# EasyEDA Pro project ros小车控制板.epro, board ROS-CAR-PCB
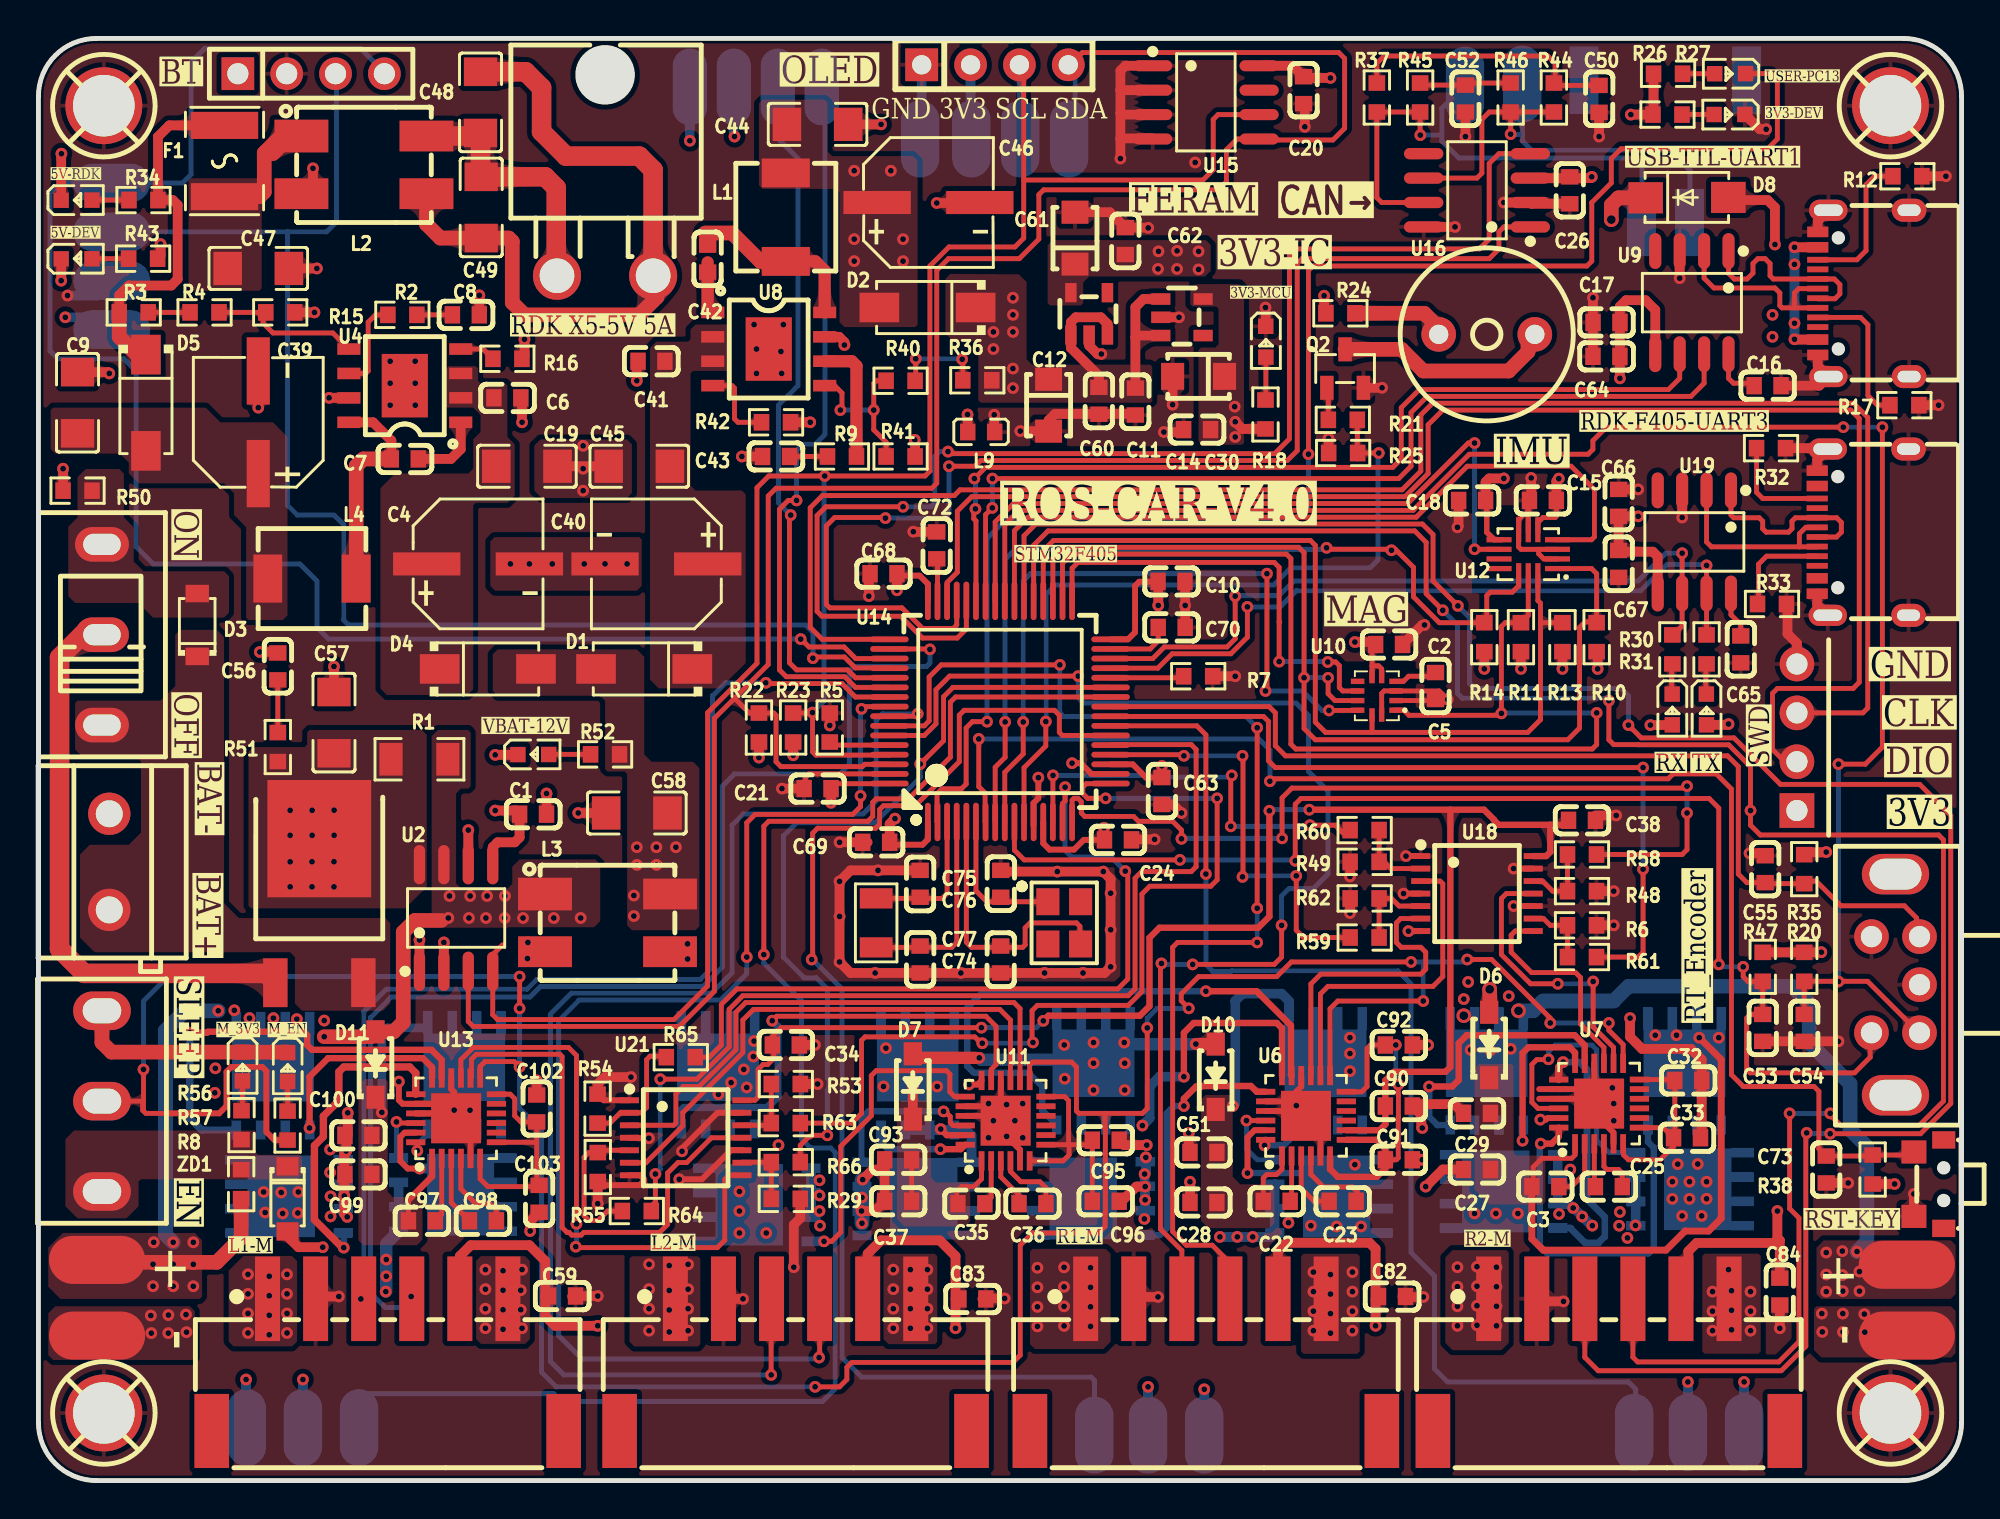
[diagram p3: board, top side]
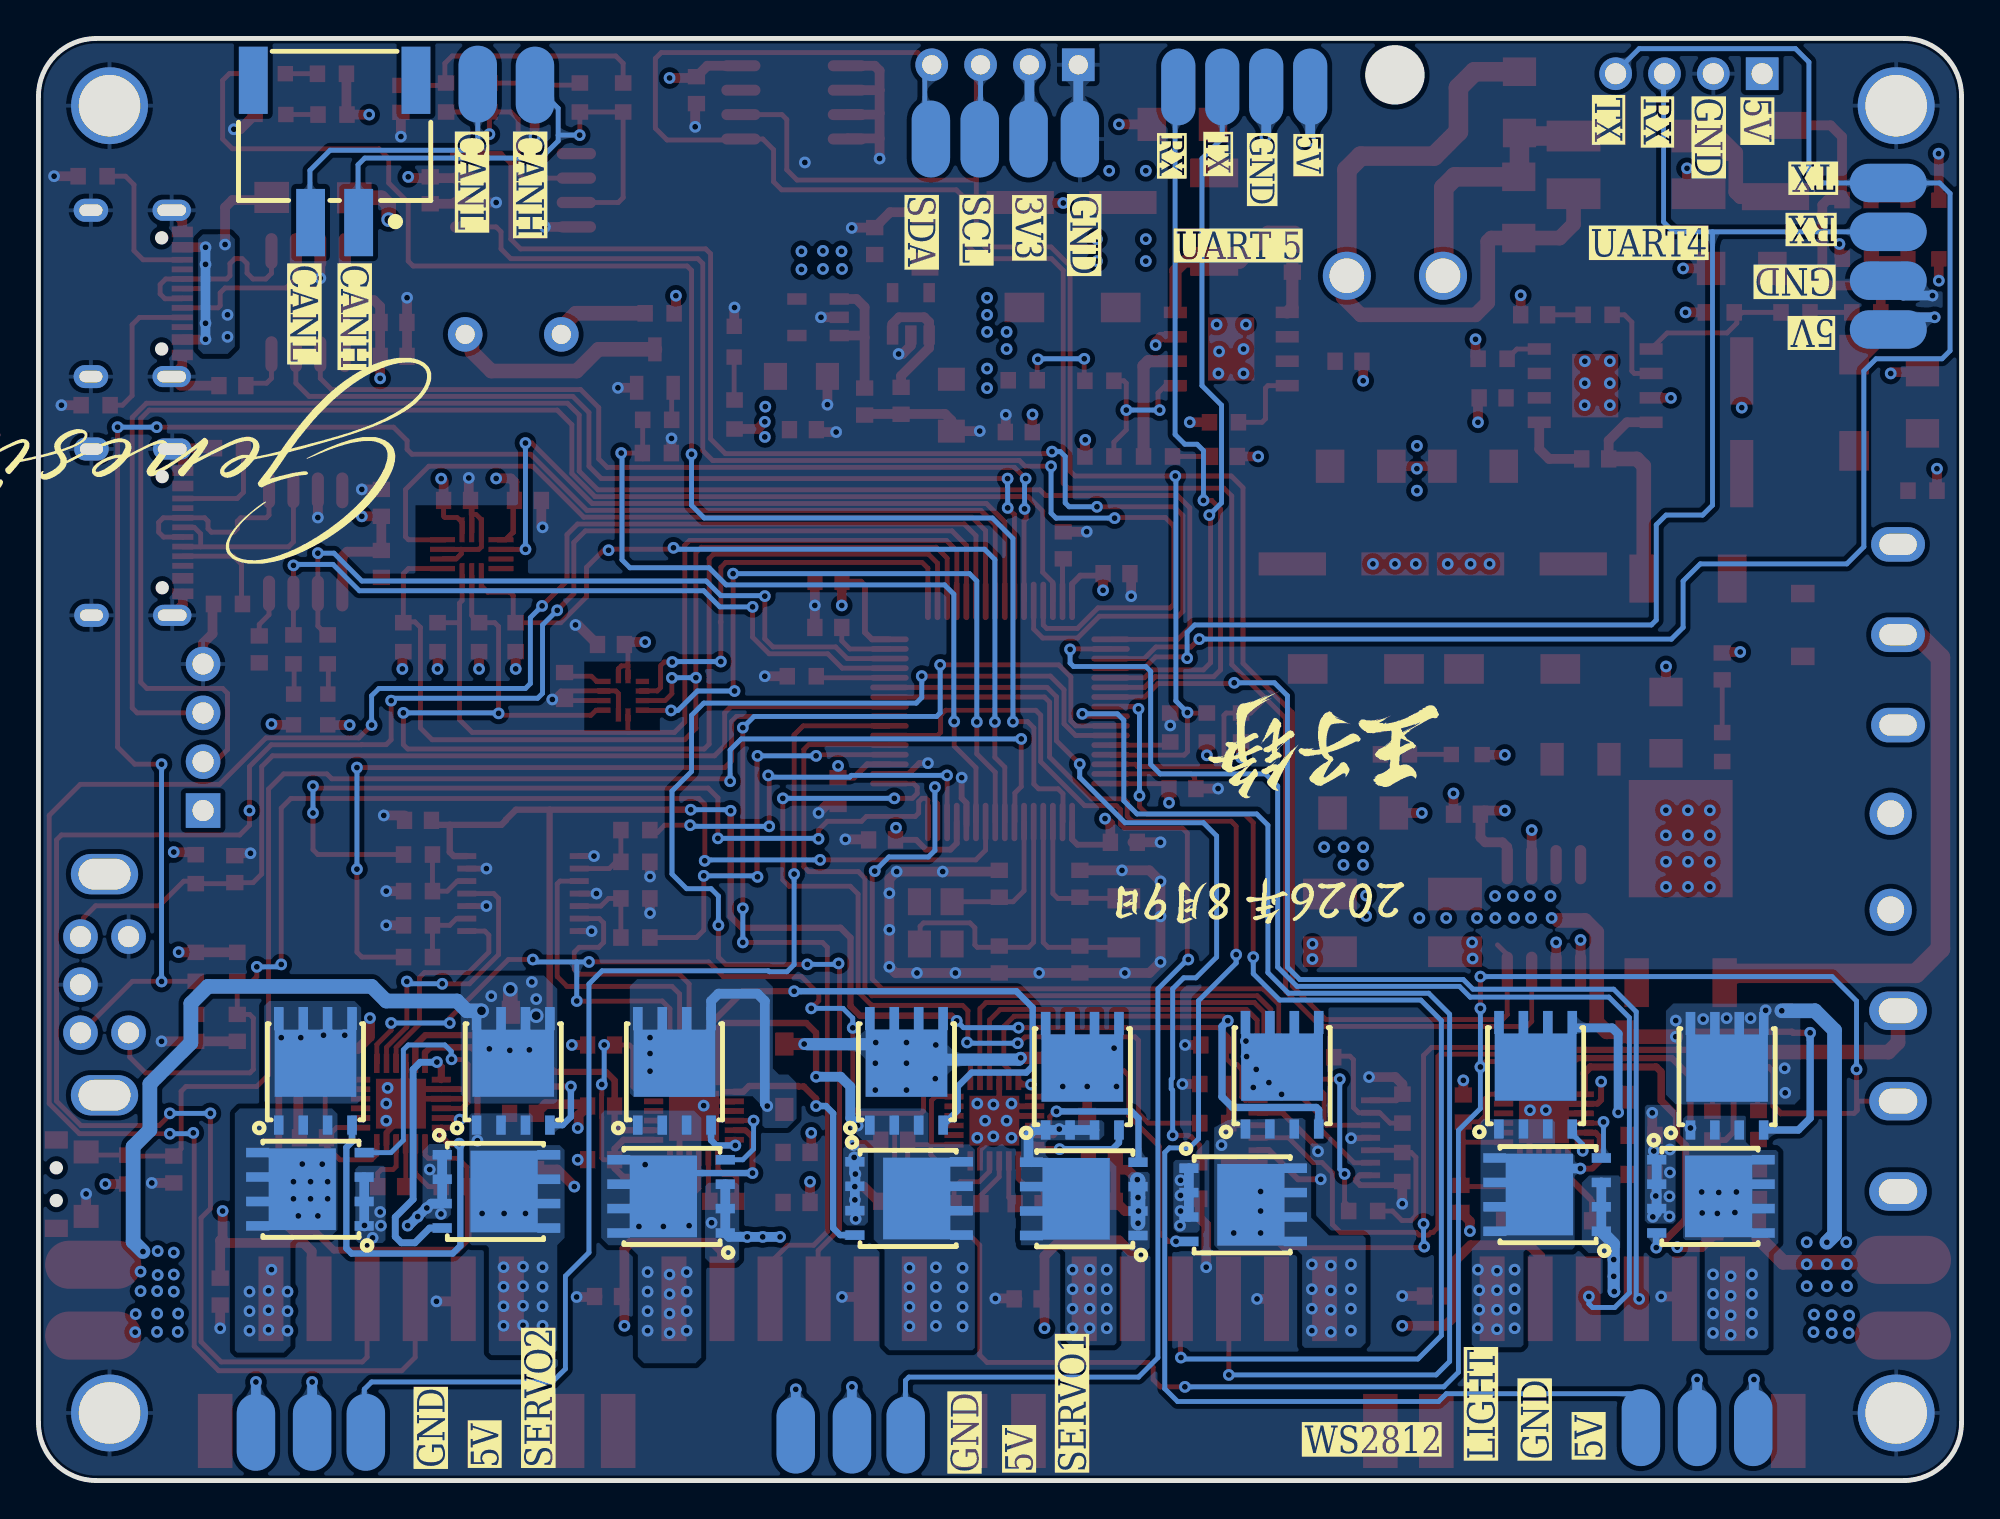
[diagram p4: board, bottom side, seen from below]

Outline 100 x 75 mm; copper layers: Top Layer, GND, VCC, Bottom Layer. Coordinates in mm from the lower left corner of the outline.
Outline path: 0,72 0,3 arc(0.88,0.88) 3,0 97,0 arc(99.12,0.88) 100,3 100,72 arc(99.12,74.12) 97,75 3,75 arc(0.88,74.12) 0,72
Stack: Top Layer 0.035mm 外层铜厚1oz / Dielectric1 0.2104mm 7628 RC49% 8.6mil / GND 0.0152mm 内层铜厚 / Dielectric2 1.065mm 1.1mm H/HOZ Copper / VCC 0.0152mm 内层铜厚 / Dielectric3 0.2104mm 7628 RC49% 8.6mil / Bottom Layer 0.035mm 外层铜厚1oz

## Design rules (mm)
net TC_DP: DP1
net TC_DN: DP1
net TC1_DP: DP2
net TC1_DN: DP2
spacing copperThickness1oz (default): track to track 0.102, other pairs 0.152 to 0.3
spacing copperThickness2oz: track to track 0.203, other pairs 0.152 to 0.3
spacing Plane_innerPlane: track to track 0.102, other pairs 0.152 to 0.3
spacing Copper_copperRegion: track to track 0.102, other pairs 0.152 to 0.3
spacing Copper_FULL: track to track 0.102, other pairs 0.152 to 0.3
spacing Copper_copperRegion_copperThickness1oz: track to track 0.102, other pairs 0.152 to 0.3
spacing Copper_copperRegion_Copper_copperRegion: track to track 0.102, other pairs 0.152 to 0.3
spacing Copper_copperRegion_Copper_FULL: track to track 0.102, other pairs 0.152 to 0.3
track width copperThickness1oz (default): min 0.127, default 0.254, max 2.54
track width copperThickness2oz: min 0.203, default 0.254, max 2.54
track width PWR: min 0.127, default 0.508, max 2.54
differential pair differentialPair (default): width min 0.127, default 0.254, max 2.54; gap min 0.152, default 0.152
net 5V uses FULL, PWR
net 3V3 uses PWR, copperRegion_copperThickness1oz
net GND uses PWR, copperRegion_copperThickness1oz
net ML1_OUTN uses PWR
net ML1_OUTP uses PWR
net MR1_OUTN uses PWR
net MR1_OUTP uses PWR
net 5V_RDK uses PWR
net DGND uses PWR, copperRegion_copperThickness1oz
net ML2_OUTN uses PWR
net ML2_OUTP uses PWR
net MR2_OUTN uses PWR
net MR2_OUTP uses PWR
net PGND uses PWR, copperRegion_copperThickness1oz
net VCCBAT uses PWR, copperRegion_copperThickness1oz
pour e1276 uses Copper_FULL, copperRegion_Copper_FULL_1
net VIN uses copperRegion_copperThickness1oz_1
pour e3355 uses Copper_FULL, copperRegion_Copper_FULL_1
pour e3357 uses Copper_copperRegion_copperThickness1oz, copperRegion_Copper_copperRegion_copperThickness1oz
pour e3399 uses Copper_copperRegion_copperThickness1oz, copperRegion_Copper_copperRegion_copperThickness1oz
pour e3413 uses Copper_copperRegion_copperThickness1oz, copperRegion_Copper_copperRegion_copperThickness1oz
pour e3419 uses Copper_copperRegion_copperThickness1oz, copperRegion_Copper_copperRegion_copperThickness1oz
pour e3481 uses Copper_copperRegion_copperThickness1oz, copperRegion_Copper_copperRegion_copperThickness1oz
pour e3537 uses Copper_copperRegion_copperThickness1oz, copperRegion_Copper_copperRegion_copperThickness1oz
pour e3834 uses Copper_copperRegion_copperThickness1oz, copperRegion_Copper_copperRegion_copperThickness1oz
net 3V3_MCU uses copperRegion_copperThickness1oz_1

## Placement (name value [footprint] x y rotation side)
5V  -  [Test-Point-0.5mm]  33.87 72.48 180 bottom
B1  HX-9042  [BUZ-TH_BD9.0-P4.00-D0.6-FD]  75.31 59.61 0 top
C1  100nF  [C0603]  25.72 34.66 180 top
C2  100nF  [C0603_1]  70.23 43.48 0 top
C3  1uF  [C0603_3]  78.36 15.29 180 top
C4  100uF  [CAP-SMD_BD6.3-L6.6-W6.6-LS7.6-FD-1]  22.86 47.67 0 top
C5  100nF  [C0603_1]  72.64 41.32 270 top
C6  100nF  [C0603]  24.38 56.31 180 top
C7  100nF  [C0603]  19.05 53.13 180 top
C8  100nF  [C0603]  22.22 60.63 180 top
C9  100nF  [C1206]  2.03 56.05 270 top
C10  100nF  [C0603_1]  58.92 46.76 0 top
C11  100nF  [C0603]  57.04 56.12 90 top
C12  10uF  [CAP-SMD_L3.2-W1.6]  52.53 55.93 270 top
C14  10uF  [CAP-SMD_L3.2-W1.6]  60.32 57.43 180 top
C15  100nF  [C0603_1]  78.23 50.97 0 top
C16  100nF  [C0603_1]  89.92 56.94 180 top
C17  100nF  [C0603_1]  81.54 60.23 0 top
C18  100nF  [C0603_1]  74.55 50.97 180 top
C19  100nF  [C1206]  25.4 52.75 180 top
C20  100nF  [C0603_1]  65.79 72.31 270 top
C21  100nF  [C0603_1]  40.51 35.99 180 top
C22  1uF  [C0603_3]  64.39 14.53 180 top
C23  100nF  [C0603_3]  67.82 14.53 0 top
C24  100nF  [C0603_1]  56.13 33.32 0 top
C25  100nF  [C0603_3]  81.66 15.29 0 top
C26  100nF  [C0603_1]  79.63 67.1 90 top
C27  100nF  [C0603_3]  74.8 16.18 0 top
C28  100nF  [C0603_3]  60.58 14.46 0 top
C29  10uF  [C0603_3]  74.8 19.1 180 top
C30  100nF  [C0603]  60.25 54.66 0 top
C32  1uF  [C0603_3]  85.79 20.81 180 top
C33  1uF  [C0603_3]  85.72 17.83 0 top
C34  1uF  [C0603_3]  38.86 22.65 180 top
C35  1uF  [C0603_3]  48.51 14.4 180 top
C36  100nF  [C0603_3]  51.69 14.4 0 top
C37  100nF  [C0603_3]  44.7 14.53 0 top
C38  1uF  [C0603_3]  80.26 34.34 180 top
C39  220uF  [CAP-SMD_BD6.3-L6.6-W6.6-LS7.2-FD]  11.43 55.04 90 top
C40  100uF  [CAP-SMD_BD6.3-L6.6-W6.6-LS7.6-FD-1]  32.13 47.67 180 top
C41  100nF  [C0603]  31.88 58.21 0 top
C42  100nF  [C0603]  34.8 63.55 90 top
C43  100nF  [C0603]  38.35 53.26 0 top
C44  100nF  [C1206]  40.51 70.53 180 top
C45  100nF  [C1206]  31.24 52.75 0 top
C46  220uF  [CAP-SMD_BD6.3-L6.6-W6.6-LS7.2-FD]  46.28 66.47 0 top
C47  10uF  [C1206]  11.43 63.04 180 top
C48  22uF  [C1206]  22.99 71.67 270 top
C49  22uF  [C1206]  23.02 66.21 90 top
C50  47nF  [C0603]  81.15 71.86 270 top
C51  10uF  [C0603_3]  60.58 17.06 180 top
C52  47nF  [C0603]  74.2 71.87 90 top
C53  100nF  [C0603_1]  89.66 23.54 90 top
C54  100nF  [C0603_1]  91.82 23.54 90 top
C55  100nF  [C0603_1]  89.79 31.8 90 top
C56  100nF  [C0603]  12.45 42.34 270 top
C57  10uF  [C1206]  15.37 39.42 270 top
C58  22uF  [C1206]  31.12 34.72 0 top
C59  100nF  [C0603]  27.23 9.6 180 top
C60  100nF  [C0603]  55.14 56.16 90 top
C61  10uF  [CAP-SMD_L3.2-W1.6]  53.9 64.61 90 top
C62  100nF  [C0603]  56.51 64.46 270 top
C63  100nF  [C0603_1]  58.42 35.86 270 top
C64  100nF  [C0603]  81.53 58.47 180 top
C65  0.1uF  [C0603]  88.52 43.23 270 top
C66  0.1uF  [C0603]  82.17 50.85 90 top
C67  100nF  [C0603]  82.17 47.67 270 top
C68  100nF  [C0603_1]  43.94 47.16 180 top
C69  100nF  [C0603_1]  43.56 33.19 180 top
C70  2.2uF  [C0603_5]  58.93 44.37 0 top
C72  2.2uF  [C0603_5]  46.71 48.64 90 top
C73  100nF  [C0603_1]  92.96 16.18 90 top
C74  22pF  [C0603_5]  50.04 27.1 90 top
C75  10pF  [C0603_5]  45.85 31.03 90 top
C76  22pF  [C0603_5]  50.04 31.03 270 top
C77  10pF  [C0603_5]  45.85 27.1 270 top
C82  100nF  [C0603]  70.38 9.57 180 top
C83  100nF  [C0603]  48.56 9.44 180 top
C84  100nF  [C0603]  90.55 9.83 90 top
C90  1uF  [C0603_3]  70.74 19.48 180 top
C91  1uF  [C0603_3]  70.74 16.68 180 top
C92  1uF  [C0603_3]  70.74 22.65 0 top
C93  10uF  [C0603_3]  44.7 16.68 180 top
C95  1uF  [C0603_3]  55.5 17.7 180 top
C96  1uF  [C0603_3]  55.5 14.53 0 top
C97  1uF  [C0603_3]  19.94 13.51 180 top
C98  100nF  [C0603_3]  23.11 13.51 0 top
C99  100nF  [C0603_3]  16.64 15.92 0 top
C100  10uF  [C0603_3]  16.64 17.95 180 top
C102  1uF  [C0603_3]  25.91 19.35 270 top
C103  1uF  [C0603_3]  26.03 14.65 270 top
CN1  ZX-XH2.54-2PWT  [CONN-SMD_2P-P2.54_MEGASTAR_ZX-XH2.54-2PWT]  84.6 69.12 0 bottom
CN2  HCZZ0021-6  [CONN-SMD_HCZZ0021-6]  60.71 6.02 0 top
CN6  HCZZ0021-6  [CONN-SMD_HCZZ0021-6]  81.66 6.02 0 top
CN7  XT30APW-M  [CONN-TH_XT30APW-M]  29.46 62.66 0 top
CN14  HCZZ0021-6  [CONN-SMD_HCZZ0021-6]  39.37 6.02 0 top
CN15  HCZZ0021-6  [CONN-SMD_HCZZ0021-6]  18.16 6.02 0 top
CRYSTAL1  8MHz  [CRYSTAL-SMD_4P-L3.2-W2.5-BL_SIT8008BI_1]  53.34 29 270 top
D1  SS54  [SMA_L4.4-W2.8-LS5.4-R-RD]  31.5 42.21 180 top
D2  SS54  [SMA_L4.4-W2.8-LS5.4-R-RD]  46.23 61.01 180 top
D3  BZT52C16  [SOD-123_L2.7-W1.6-LS3.7-RD]  8.25 44.5 90 top
D4  SS54  [SMA_L4.4-W2.8-LS5.4-R-RD]  23.37 42.21 0 top
D5  SS54  [SMA_L4.4-W2.8-LS5.4-R-RD]  5.59 56.05 270 top
D6  1N5819HW  [SOD-123_L2.7-W1.6-LS3.7-RD-1]  75.44 22.65 90 top
D7  1N5819HW  [SOD-123_L2.7-W1.6-LS3.7-RD-1]  45.47 20.49 90 top
D8  SS54  [SMA_L4.3-W2.6-LS5.0-FD]  85.72 66.72 180 top
D10  1N5819HW  [SOD-123_L2.7-W1.6-LS3.7-RD-1]  61.21 21 90 top
D11  1N5819HW  [SOD-123_L2.7-W1.6-LS3.7-RD-1]  17.53 21.64 90 top
F1  BSMD1812-400-16V  [F1812]  9.67 68.62 270 top
GND  -  [Test-Point-0.5mm]  36.16 72.48 180 bottom
H1  -  [HDR-TH_4P-P2.54-V-F]  14.18 73.17 0 top
H3  PZ254R-11-04P  [HDR-TH_4P-P2.54-H-M-W10.4]  91.44 38.66 90 top
K1  -  [SW-TH_SS-12D10-G050]  3.3 43.99 90 top
L1  4.7uH  [IND-SMD_L5.5-W5.2]  38.86 65.71 90 top
L2  ACM7060F-701T40  [FILTER-SMD_4P-L7.0-W6.0-TL_ACM7060F]  16.92 68.42 0 top
L3  ACM7060F-701T40  [FILTER-SMD_4P-L7.0-W6.0-TL_ACM7060F]  29.59 29 0 top
L4  4.7uH  [IND-SMD_L5.5-W5.2]  14.22 46.91 180 top
L9  FBMA-11-160808-221A20T  [L0603]  49.02 54.53 0 top
LED1  -  [LED_0603]  87.88 71.04 180 top
LED2  -  [LED_0603]  87.91 73.16 180 top
LED3  -  [LED_0603]  2.03 63.55 0 top
LED4  -  [LED_0603]  2.03 66.59 0 top
LED5  -  [LED_0603]  25.78 37.77 0 top
LED6  -  [LED_0603]  84.96 40.05 270 top
LED7  -  [LED_0603]  86.74 40.05 270 top
LED8  -  [LED_0603]  63.83 59.18 270 top
NOREF  -  [Pad_e1722]  3.05 7.54 90 top
NOREF#2  -  [Pad_e500]  51.05 69.77 0 top
NOREF#3  -  [Pad_e492]  57.7 2.36 0 top
NOREF#4  -  [Pad_e496]  13.75 2.75 0 top
NOREF#5  -  [Pad_e502]  82.98 2.51 0 top
NOREF#6  -  [Pad_e1721]  3.05 11.48 90 top
NOREF#7  -  [Pad_e501]  53.59 69.77 180 top
NOREF#8  -  [Pad_e506]  3.81 62.4 270 top
NOREF#9  -  [Pad_e491]  77.16 72.62 0 top
NOREF#10  -  [Pad_e4011]  97.16 11.22 90 top
NOREF#11  -  [Pad_e503]  85.77 2.51 0 top
NOREF#12  -  [Pad_e507]  3.81 64.94 90 top
NOREF#13  -  [Pad_e498]  45.85 69.77 0 top
NOREF#14  -  [Pad_e505]  3.81 59.86 90 top
NOREF#15  -  [Pad_e499]  48.51 69.77 0 top
NOREF#16  -  [Pad_e4010]  97.16 7.54 90 top
NOREF#17  -  [Pad_e497]  16.67 2.75 0 top
NOREF#18  -  [Pad_e508]  3.81 67.48 90 top
NOREF#19  -  [Pad_e490]  74.18 72.57 0 top
NOREF#20  -  [Pad_e493]  60.62 2.36 0 top
NOREF#21  -  [Pad_e495]  10.83 2.75 0 top
NOREF#22  -  [Pad_e504]  88.69 2.51 0 top
NOREF#23  -  [Pad_e494]  54.91 2.36 0 top
OLED1  HS96L01W4S03  [OLED-TH_HS96L01W4S03]  49.78 73.47 0 top
Q2  S8050  [SOT-23-3_L2.9-W1.3-P1.90-LS2.4-BR]  67.94 57.83 270 top
Q3  HY19P03D  [TO-252-3_L6.5-W5.8-P4.58-BL]  14.61 29.64 0 top
Q4  TPH1R403NL,L1Q(M  [DSOP-8_L5.0-W5.0-P1.27-LS6.0-BL-EP]  85.6 21.26 180 bottom
Q5  TPH1R403NL,L1Q(M  [DSOP-8_L5.0-W5.0-P1.27-LS6.0-BL-EP]  85.83 15.15 90 bottom
Q6  TPH1R403NL,L1Q(M  [DSOP-8_L5.0-W5.0-P1.27-LS6.0-BL-EP]  76.24 15.04 270 bottom
Q7  TPH1R403NL,L1Q(M  [DSOP-8_L5.0-W5.0-P1.27-LS6.0-BL-EP]  75.31 21.26 180 bottom
Q8  TPH1R403NL,L1Q(M  [DSOP-8_L5.0-W5.0-P1.27-LS6.0-BL-EP]  45.72 21 180 bottom
Q9  TPH1R403NL,L1Q(M  [DSOP-8_L5.0-W5.0-P1.27-LS6.0-BL-EP]  45.59 14.65 90 bottom
Q10  TPH1R403NL,L1Q(M  [DSOP-8_L5.0-W5.0-P1.27-LS6.0-BL-EP]  37.41 14.34 270 bottom
Q11  TPH1R403NL,L1Q(M  [DSOP-8_L5.0-W5.0-P1.27-LS6.0-BL-EP]  35.33 21.05 180 bottom
Q20  TPH1R403NL,L1Q(M  [DSOP-8_L5.0-W5.0-P1.27-LS6.0-BL-EP]  66.93 21.26 180 bottom
Q21  TPH1R403NL,L1Q(M  [DSOP-8_L5.0-W5.0-P1.27-LS6.0-BL-EP]  67.06 14.78 90 bottom
Q22  TPH1R403NL,L1Q(M  [DSOP-8_L5.0-W5.0-P1.27-LS6.0-BL-EP]  54.78 14.67 270 bottom
Q23  TPH1R403NL,L1Q(M  [DSOP-8_L5.0-W5.0-P1.27-LS6.0-BL-EP]  54.86 21.26 180 bottom
Q24  TPH1R403NL,L1Q(M  [DSOP-8_L5.0-W5.0-P1.27-LS6.0-BL-EP]  22.15 21.05 180 bottom
Q25  TPH1R403NL,L1Q(M  [DSOP-8_L5.0-W5.0-P1.27-LS6.0-BL-EP]  21.5 14.87 90 bottom
Q26  TPH1R403NL,L1Q(M  [DSOP-8_L5.0-W5.0-P1.27-LS6.0-BL-EP]  13.08 14.78 270 bottom
Q27  TPH1R403NL,L1Q(M  [DSOP-8_L5.0-W5.0-P1.27-LS6.0-BL-EP]  12.19 21 180 bottom
R1  10mR  [R1206]  19.81 37.51 0 top
R2  10K  [R0603_2]  18.92 60.63 180 top
R3  10K  [R0603_2]  4.95 60.75 180 top
R4  1.5K  [R0603_2]  8.64 60.75 180 top
R5  10kΩ  [R0603_1]  41.15 39.16 90 top
R6  10kΩ  [R0603_6]  80.26 28.88 0 top
R7  10K  [R0603_8]  60.31 41.83 180 top
R8  2.2K  [R0603_7]  10.54 15.41 270 top
R9  10K  [R0603_2]  41.78 53.26 0 top
R10  10kΩ  [R0603_1]  81.03 43.86 270 top
R11  2.2kΩ  [R0603_1]  77.09 43.86 270 top
R12  5.1K  [R0603]  97.18 67.84 180 top
R13  2.2kΩ  [R0603_1]  79.25 43.86 270 top
R14  10kΩ  [R0603_1]  75.18 43.86 270 top
R15  10K  [R0603_2]  12.57 60.75 0 top
R16  10K  [R0603_2]  24.38 58.34 180 top
R17  5.1K  [R0603]  97.03 55.93 180 top
R18  470R  [R0603]  63.81 55.44 270 top
R20  10K  [R0603]  91.82 26.72 90 top
R21  10K  [R0603_2]  67.83 55.17 180 top
R22  2.2K  [R0603_8]  37.47 39.16 270 top
R23  2.2K  [R0603_8]  39.24 39.16 270 top
R24  10K  [R0603_2]  67.7 60.71 0 top
R25  10K  [R0603_2]  67.84 53.44 180 top
R26  470R  [R0603]  84.71 71.04 180 top
R27  1K  [R0603]  84.74 73.16 180 top
R29  10kΩ  [R0603_6]  38.86 14.65 0 top
R30  10K  [R0603_2]  84.96 43.23 270 top
R31  10K  [R0603_2]  86.74 43.23 270 top
R32  5.1K  [R0603]  90.09 53.69 180 top
R33  5.1K  [R0603]  90.14 45.59 180 top
R34  10K  [R0603_2]  5.46 66.59 0 top
R35  10K  [R0603]  91.82 31.8 90 top
R36  10K  [R0603_2]  48.82 57.22 0 top
R37  60R  [R0603]  69.6 71.93 270 top
R38  10K  [R0603_8]  95.38 16.18 270 top
R40  1.5K  [R0603_2]  44.83 57.2 0 top
R41  10K  [R0603_2]  44.83 53.26 0 top
R42  10K  [R0603_2]  38.35 55.04 180 top
R43  10K  [R0603_2]  5.44 63.55 0 top
R44  60R  [R0603]  78.8 71.93 90 top
R45  60R  [R0603]  71.85 71.93 270 top
R46  60R  [R0603]  76.55 71.93 90 top
R47  10K  [R0603]  89.66 26.72 90 top
R48  10kΩ  [R0603_6]  80.26 30.65 180 top
R49  10kΩ  [R0603_6]  68.96 32.18 0 top
R50  10K  [R0603_2]  2.03 51.48 0 top
R51  10K  [R0603_2]  12.45 38.15 270 top
R52  10K  [R0603_2]  29.46 37.77 0 top
R53  10kΩ  [R0603_6]  38.86 20.62 180 top
R54  10kΩ  [R0603_6]  29.07 19.34 270 top
R55  10kΩ  [R0603_6]  29.08 16.3 90 top
R56  2.2kΩ  [R0603_6]  10.56 18.49 270 top
R57  2.2kΩ  [R0603_6]  12.95 18.46 270 top
R58  10kΩ  [R0603_6]  80.26 32.56 0 top
R59  10kΩ  [R0603_6]  68.96 28.24 180 top
R60  10kΩ  [R0603_6]  68.96 33.83 180 top
R61  10kΩ  [R0603_6]  80.26 27.22 0 top
R62  10kΩ  [R0603_6]  68.96 30.27 0 top
R63  10kΩ  [R0603_6]  38.86 18.59 0 top
R64  10kΩ  [R0603_6]  31.12 14.02 0 top
R65  10kΩ  [R0603_6]  33.4 22.02 0 top
R66  10kΩ  [R0603_6]  38.86 16.56 0 top
RX  -  [Test-Point-0.5mm]  40.73 72.48 180 bottom
SCREW1  -  [M3螺丝]  3.46 3.45 0 top
SCREW2  -  [M3螺丝]  96.37 71.44 0 top
SCREW3  -  [M3螺丝]  96.37 3.45 0 top
SCREW4  -  [M3螺丝]  3.46 71.44 0 top
SW1  EC11L1525G01  [SW-TH_ALPS_EC11L1525G01]  97.82 23.29 90 top
SW3  SS-12D10L5  [SW-TH_SS-12D10L5]  3.3 19.73 270 top
SW5  TS24CA  [SW-SMD_TS24CA_1]  98.3 15.41 270 top
TX  -  [Test-Point-0.5mm]  38.44 72.48 180 bottom
U1  RT9013-33GB  [SOT-23-5_L2.9-W1.6-P0.95-LS2.8-BR]  54.64 60.68 270 top
U2  INA219AID  [SOIC-8_L4.9-W3.9-P1.27-LS6.0-BL]  21.72 29.26 0 top
U3  KF301-5.0-2P  [CONN-TH_P5.00_KF301-5.0-2P]  3.68 32.18 270 top
U4  SCT2450STER  [ESOP-8_L4.9-W3.9-P1.27-LS6.0-BL-EP]  19.05 56.94 90 top
U5  RT9013-33GB  [SOT-23-5_L2.9-W1.6-P0.95-LS2.8-BR]  59.46 60.5 180 top
U6  DRV8701ERGER  [VQFN-24_L4.0-W4.0-P0.50-BL-EP2.5_1]  65.91 18.97 0 top
U7  DRV8701ERGER  [VQFN-24_L4.0-W4.0-P0.50-BL-EP2.5_1]  81.15 19.61 0 top
U8  SCT2450STER  [ESOP-8_L4.9-W3.9-P1.27-LS6.0-BL-EP]  37.97 58.85 270 top
U9  CH340N  [SOP-8_L4.9-W3.9-P1.27-LS6.0-BL]  85.98 61.26 180 top
U10  LIS3MDLTR  [LGA-12_L2.0-W2.0-P0.50-BL]  69.6 40.81 90 top
U11  DRV8701ERGER  [VQFN-24_L4.0-W4.0-P0.50-BL-EP2.5_1]  50.29 18.72 0 top
U12  LSM6DSRTR  [LGA-14_L3.0-W2.5-P0.50-BR]  77.47 48.18 0 top
U13  DRV8701ERGER  [VQFN-24_L4.0-W4.0-P0.50-BL-EP2.5_1]  21.72 18.84 0 top
U14  STM32F405RGT6  [LQFP-64_L10.0-W10.0-P0.50-LS12.0-BL]  50 40 0 top
U15  MB85RC64TAPNF-G-BDERE1  [SOP-8_L5.0-W4.0-P1.27-LS6.0-BL]  60.71 71.67 270 top
U16  TJA1050T-JSM  [SOIC-8_L4.9-W3.9-P1.27-LS6.0-BL]  74.8 67.1 90 top
U18  SN74HC125PWR  [TSSOP-14_L5.0-W4.4-P0.65-LS6.5-BL]  74.8 30.53 270 top
U19  CH340N  [SOP-8_L4.9-W3.9-P1.27-LS6.0-BL]  86.11 48.81 180 top
U21  SN74HC125PWR  [TSSOP-14_L5.0-W4.4-P0.65-LS6.5-BL]  33.66 17.83 270 top
USB1  TYPE-C 16PIN 2MD(073)  [USB-C-SMD_TYPE-C-6PIN-2MD-073]  94.9 61.74 90 top
USB2  TYPE-C 16PIN 2MD(073)  [USB-C-SMD_TYPE-C-6PIN-2MD-073]  94.87 49.32 90 top
X1  32.768kHz  [OSC-SMD_L3.2-W1.5]  43.56 29 90 top
ZD1  BZT52C3V3  [SOD-123_L2.8-W1.8-LS3.7-RD]  12.95 14.65 270 top
使能  NCD0603Y2  [LED0603-RD]  12.95 21.51 270 top
电源  NCD0603Y2  [LED0603-RD]  10.61 21.53 270 top

## Footprints (pads in the part's own frame, mm; a bottom-side part is the same pattern mirrored in y, then rotated)
BUZ-TH_BD9.0-P4.00-D0.6-FD
  round 1.8 hole 1: 1(-2.5,0) 2(2.5,0)
C0603
  rect 0.8x0.9 smd: 1(-0.7,0) 2(0.7,0)
C0603_1
  rect 0.8x0.9 smd: 1(-0.7,0) 2(0.7,0)
C0603_3
  rect 0.8x0.9 smd: 1(-0.7,0) 2(0.7,0)
C0603_5
  rect 0.8x0.9 smd: 1(-0.7,0) 2(0.7,0)
C1206
  rect 1.485x1.728 smd: 1(-1.593,0) 2(1.593,0)
CAP-SMD_BD6.3-L6.6-W6.6-LS7.2-FD
  rect 3.5x1.2 smd: 1(-2.67,0) 2(2.67,0)
CAP-SMD_BD6.3-L6.6-W6.6-LS7.6-FD-1
  rect 3.5x1.2 smd: 1(-2.67,0) 2(2.67,0)
CAP-SMD_L3.2-W1.6
  rect 1.2x1.4 smd: 1(-1.35,0) 2(1.35,0)
CONN-SMD_2P-P2.54_MEGASTAR_ZX-XH2.54-2PWT
  rect 1.5x3.5 smd: 1(-1.25,3.7) 2(1.25,3.7) 3(-4.23,-3.7) 4(4.23,-3.7)
CONN-SMD_HCZZ0021-6
  rect 1.3x4.4 smd: 1(-6.25,3.438) 2(-3.75,3.438) 3(-1.25,3.438) 4(1.25,3.438) 5(3.75,3.438) 6(6.25,3.438)
  rect 1.8x3.85 smd: 7(-9.15,-3.438) 8(9.15,-3.438)
CONN-TH_P5.00_KF301-5.0-2P
  round 2.2 hole 1.4: 1(-2.5,0) 2(2.5,0)
CONN-TH_XT30APW-M
  round 2.5 hole 1.8: 1(-2.5,0) 2(2.5,0)
CRYSTAL-SMD_4P-L3.2-W2.5-BL_SIT8008BI_1
  rect 1.4x1.2 smd: 1(-1.1,-0.85) 2(1.1,-0.85) 3(1.1,0.85) 4(-1.1,0.85)
DSOP-8_L5.0-W5.0-P1.27-LS6.0-BL-EP
  rect 0.5x1 smd: 1(-1.905,-2.77) 2(-0.635,-2.77) 3(0.634,-2.77) 4(1.905,-2.77)
  rect 0.5x1.2 smd: 5(1.905,2.77) 6(0.635,2.77) 7(-0.634,2.77) 8(-1.905,2.77)
  custom 4.25x3.5 smd: 9(0,0.45)
ESOP-8_L4.9-W3.9-P1.27-LS6.0-BL-EP
  rect 0.6x1.2 smd: 1(-1.905,-2.909) 2(-0.635,-2.909) 3(0.635,-2.909) 4(1.905,-2.909) 5(1.905,2.909) 6(0.635,2.909) 7(-0.635,2.909) 8(-1.905,2.909)
  rect 3.3x2.4 smd: 9(0,0)
F1812
  rect 1.407x3.499 smd: 1(-1.853,0) 2(1.853,0)
FILTER-SMD_4P-L7.0-W6.0-TL_ACM7060F
  rect 2.8x1.7 smd: 1(-3.251,1.5)
  rect 2.8x1.6 smd: 2(-3.251,-1.5) 3(3.251,-1.5) 4(3.251,1.5)
HDR-TH_4P-P2.54-H-M-W10.4
  rect 1.8x1.8 hole 1.1: 1(-3.81,0)
  round 1.8 hole 1.1: 2(-1.27,0) 3(1.27,0) 4(3.81,0)
HDR-TH_4P-P2.54-V-F
  rect 1.7x1.7 hole 1.1: 1(-3.81,0)
  round 1.7 hole 1.1: 2(-1.27,0) 3(1.27,0) 4(3.81,0)
IND-SMD_L5.5-W5.2
  rect 1.5x2.5 smd: 1(-2.3,0) 2(2.3,0)
L0603
  rect 0.8x0.864 smd: 1(-0.7,0) 2(0.7,0)
LED0603-RD
  rect 0.8x0.8 smd: 1(-0.749,0) 2(0.749,0)
LED_0603
  rect 0.8x0.8 smd: 1(-0.851,-0.01) 2(0.75,-0.005)
LGA-12_L2.0-W2.0-P0.50-BL
  rect 0.28x0.7 smd: 1(-0.75,-1) 2(-0.25,-1) 3(0.25,-1) 4(0.75,-1) 7(0.75,1) 8(0.25,1) 9(-0.25,1) 10(-0.75,1)
  rect 0.7x0.28 smd: 5(1,-0.25) 6(1,0.25) 11(-1,0.25) 12(-1,-0.25)
LGA-14_L3.0-W2.5-P0.50-BR
  rect 1.3x0.27 smd: 1(1.52,-0.75) 2(1.52,-0.25) 3(1.52,0.25) 4(1.52,0.75) 8(-1.52,0.75) 9(-1.52,0.25) 10(-1.52,-0.25) 11(-1.52,-0.75)
  rect 0.27x1.3 smd: 5(0.5,1.27) 6(0,1.27) 7(-0.5,1.27) 12(-0.5,-1.12) 13(0,-1.12) 14(0.5,-1.12)
LQFP-64_L10.0-W10.0-P0.50-LS12.0-BL
  oval 0.3x2 smd: 1(-3.75,-5.75) 2(-3.25,-5.75) 3(-2.75,-5.75) 4(-2.25,-5.75) 5(-1.75,-5.75) 6(-1.25,-5.75) 7(-0.75,-5.75) 8(-0.25,-5.75) 9(0.25,-5.75) 10(0.75,-5.75) 11(1.25,-5.75) 12(1.75,-5.75) 13(2.25,-5.75) 14(2.75,-5.75) 15(3.25,-5.75) 16(3.75,-5.75) 33(3.75,5.75) 34(3.25,5.75) 35(2.75,5.75) 36(2.25,5.75) 37(1.75,5.75) 38(1.25,5.75) 39(0.75,5.75) 40(0.25,5.75) 41(-0.25,5.75) 42(-0.75,5.75) 43(-1.25,5.75) 44(-1.75,5.75) 45(-2.25,5.75) 46(-2.75,5.75) 47(-3.25,5.75) 48(-3.75,5.75)
  oval 2x0.3 smd: 17(5.75,-3.75) 18(5.75,-3.25) 19(5.75,-2.75) 20(5.75,-2.25) 21(5.75,-1.75) 22(5.75,-1.25) 23(5.75,-0.75) 24(5.75,-0.25) 25(5.75,0.25) 26(5.75,0.75) 27(5.75,1.25) 28(5.75,1.75) 29(5.75,2.25) 30(5.75,2.75) 31(5.75,3.25) 32(5.75,3.75) 49(-5.75,3.75) 50(-5.75,3.25) 51(-5.75,2.75) 52(-5.75,2.25) 53(-5.75,1.75) 54(-5.75,1.25) 55(-5.75,0.75) 56(-5.75,0.25) 57(-5.75,-0.25) 58(-5.75,-0.75) 59(-5.75,-1.25) 60(-5.75,-1.75) 61(-5.75,-2.25) 62(-5.75,-2.75) 63(-5.75,-3.25) 64(-5.75,-3.75)
M3螺丝
  round 4 hole 3.2: 1(-0.064,0.064)
OLED-TH_HS96L01W4S03
  rect 1.7x1.7 hole 1: 1(-3.845,0.155)
  round 1.7 hole 1: 2(-1.305,0.155) 3(1.235,0.155) 4(3.775,0.155)
OSC-SMD_L3.2-W1.5
  rect 1.05x1.7 smd: 1(-1.275,0) 2(1.275,0)
Pad_e490
  oval 2x4 smd far side: 1(0,0)
Pad_e491
  oval 2x4 smd far side: 1(0,0)
Pad_e492
  oval 2x4 smd far side: 1(0,0)
Pad_e493
  oval 2x4 smd far side: 1(0,0)
Pad_e494
  oval 2x4 smd far side: 1(0,0)
Pad_e495
  oval 2x4 smd far side: 1(0,0)
Pad_e496
  oval 2x4 smd far side: 1(0,0)
Pad_e497
  oval 2x4 smd far side: 1(0,0)
Pad_e498
  oval 2x4 smd far side: 1(0,0)
Pad_e499
  oval 2x4 smd far side: 1(0,0)
Pad_e500
  oval 2x4 smd far side: 1(0,0)
Pad_e501
  oval 2x4 smd far side: 1(0,0)
Pad_e502
  oval 2x4 smd far side: 1(0,0)
Pad_e503
  oval 2x4 smd far side: 1(0,0)
Pad_e504
  oval 2x4 smd far side: 1(0,0)
Pad_e505
  oval 2x4 smd far side: 1(0,0)
Pad_e506
  oval 2x4 smd far side: 1(0,0)
Pad_e507
  oval 2x4 smd far side: 1(0,0)
Pad_e508
  oval 2x4 smd far side: 1(0,0)
Pad_e1721
  oval 2.5x5 smd: 1(0,0)
Pad_e1722
  oval 2.5x5 smd: 1(0,0)
Pad_e4010
  oval 2.5x5 smd: 1(0,0)
Pad_e4011
  oval 2.5x5 smd: 1(0,0)
R0603
  rect 0.806x0.864 smd: 1(-0.753,0) 2(0.753,0)
R0603_1
  rect 0.806x0.864 smd: 1(-0.753,0) 2(0.753,0)
R0603_2
  rect 0.806x0.864 smd: 1(-0.753,0) 2(0.753,0)
R0603_6
  rect 0.806x0.864 smd: 1(-0.753,0) 2(0.753,0)
R0603_7
  rect 0.806x0.864 smd: 1(-0.753,0) 2(0.753,0)
R0603_8
  rect 0.806x0.864 smd: 1(-0.753,0) 2(0.753,0)
R1206
  rect 1.208x1.701 smd: 1(-1.479,0) 2(1.479,0)
SMA_L4.3-W2.6-LS5.0-FD
  rect 1.8x1.62 smd: 1(-2.15,-0.009) 2(2.15,0.009)
SMA_L4.4-W2.8-LS5.4-R-RD
  rect 2.062x1.539 smd: 1(2.503,0) 2(-2.503,0)
SOD-123_L2.7-W1.6-LS3.7-RD
  rect 0.91x1.22 smd: 1(-1.635,0) 2(1.635,0)
SOD-123_L2.7-W1.6-LS3.7-RD-1
  rect 1.2x0.95 smd: 1(-1.7,0) 2(1.7,0)
SOD-123_L2.8-W1.8-LS3.7-RD
  rect 0.95x1.15 smd: 1(-1.692,0) 2(1.692,0)
SOIC-8_L4.9-W3.9-P1.27-LS6.0-BL
  oval 0.588x2.045 smd: 1(-1.905,-2.772) 2(-0.635,-2.772) 3(0.635,-2.772) 4(1.905,-2.772) 5(1.905,2.772) 6(0.635,2.772) 7(-0.635,2.772) 8(-1.905,2.772)
SOP-8_L4.9-W3.9-P1.27-LS6.0-BL
  oval 0.63x1.865 smd: 1(-1.905,-2.683) 2(-0.635,-2.683) 3(0.635,-2.683) 4(1.905,-2.683) 5(1.905,2.683) 6(0.635,2.683) 7(-0.635,2.683) 8(-1.905,2.683)
SOP-8_L5.0-W4.0-P1.27-LS6.0-BL
  oval 0.574x2.035 smd: 1(-1.905,-2.768) 2(-0.635,-2.768) 3(0.635,-2.768) 4(1.905,-2.768) 5(1.905,2.768) 6(0.635,2.768) 7(-0.635,2.768) 8(-1.905,2.768)
SOT-23-3_L2.9-W1.3-P1.90-LS2.4-BR
  rect 1.25x0.7 smd: 1(1,-0.95) 2(1,0.95) 3(-1,0)
SOT-23-5_L2.9-W1.6-P0.95-LS2.8-BR
  rect 1x0.6 smd: 1(1.1,-0.95) 2(1.1,0) 3(1.1,0.95) 4(-1.1,0.95) 5(-1.1,-0.95)
SW-SMD_TS24CA_1
  rect 0.9x1.2 smd: 1(-2.3,0.775) 2(2.3,0.775)
  rect 1.2x1.3 smd: 3(-1.675,-0.775) 4(1.675,-0.775)
SW-TH_ALPS_EC11L1525G01
  oval 2.1x3.5 hole 1.6x2.7: 6(-3.25,1.25) 7(8.25,1.25)
  round 1.8 hole 1.1: A(0,0) B(5,0) C(2.5,0) D(0,2.5) E(5,2.5)
SW-TH_SS-12D10-G050
  oval 1.8x2.8 hole 1.1x1.95: 1(-4.7,0) 2(0,0) 3(4.7,0)
SW-TH_SS-12D10L5
  oval 2x3 hole 1.3x2: 1(-4.7,0) 2(0,0) 3(4.7,0)
Test-Point-0.5mm
  oval 1.778x3.988 smd: 1(0,0)
TO-252-3_L6.5-W5.8-P4.58-BL
  rect 1.27x2.54 smd: 1(-2.288,-3.747) 3(2.288,-3.745)
  rect 5.4x6.1 smd: 2(-0.002,3.747)
TSSOP-14_L5.0-W4.4-P0.65-LS6.5-BL
  rect 0.305x0.991 smd: 1(-1.95,-2.925) 2(-1.3,-2.925) 3(-0.65,-2.925) 4(0,-2.925) 5(0.65,-2.925) 6(1.3,-2.925) 7(1.95,-2.925) 8(1.95,2.925) 9(1.3,2.925) 10(0.65,2.925) 11(0,2.925) 12(-0.65,2.925) 13(-1.3,2.925) 14(-1.95,2.925)
USB-C-SMD_TYPE-C-6PIN-2MD-073
  rect 0.55x1.1 smd: 1(-3.2,2.375) 2(-2.4,2.375) 11(2.4,2.375) 12(3.2,2.375)
  rect 0.3x1.1 smd: 3(-1.75,2.375) 4(-1.25,2.375) 5(-0.75,2.375) 6(-0.25,2.375) 7(0.25,2.375) 8(0.75,2.375) 9(1.25,2.375) 10(1.75,2.375)
  oval 1.1x2 hole 0.6x1.5: 13(-4.325,1.825) 14(4.325,1.825)
  oval 1.2x1.8 hole 0.6x1.2: 13(-4.325,-2.375) 14(4.325,-2.375)
VQFN-24_L4.0-W4.0-P0.50-BL-EP2.5_1
  rect 0.3x1 smd: 1(-1.25,-2.092) 2(-0.75,-2.092) 3(-0.25,-2.092) 4(0.25,-2.092) 5(0.75,-2.092) 6(1.25,-2.092) 13(1.25,2.092) 14(0.75,2.092) 15(0.25,2.092) 16(-0.25,2.092) 17(-0.75,2.092) 18(-1.25,2.092)
  rect 1x0.3 smd: 7(2.098,-1.25) 8(2.098,-0.75) 9(2.098,-0.25) 10(2.098,0.25) 11(2.098,0.75) 12(2.098,1.25) 19(-2.098,1.25) 20(-2.098,0.75) 21(-2.098,0.25) 22(-2.098,-0.25) 23(-2.098,-0.75) 24(-2.098,-1.25)
  rect 2.6x2.6 smd: 25(0.001,-0.001)

## Nets
As in the schematic, except:
3V3: C1.2 C2.1 C15.2 C17.2 C18.1 C20.1 C59.2 C61.1 C62.2 C64.1 C66.1 C67.1 C82.2 C83.2 C84.2 CN2.5 CN6.5 CN14.5 CN15.5 H3.1 LED6.2 LED7.2 NOREF#15.1 OLED1.2 R10.2 R11.2 R13.2 R14.2 R20.2 R24.1 R26.2 R27.2 R35.2 R38.2 R47.2 U1.5 U2.5 U9.5 U10.5 U10.6 U12.5 U12.8 U15.8 U19.5
5V: 5V.1 C11.2 C12.1 C26.2 C60.2 D2.2 D8.2 H1.1 NOREF#3.1 NOREF#11.1 NOREF#14.1 NOREF#21.1 R36.2 R43.2 U1.1 U1.3 U5.1 U5.3 U16.3
DGND: C2.2 C5.2 C10.2 C11.1 C12.2 C14.2 C15.1 C16.1 C17.1 C18.2 C20.2 C21.2 C24.2 C26.1 C30.1 C34.1 C38.1 C50.2 C52.1 C53.1 C54.1 C55.2 C59.1 C60.1 C61.2 C62.1 C63.2 C64.2 C65.2 C66.2 C67.2 C68.2 C69.2 C70.2 C72.2 C73.1 C74.1 C75.2 C76.1 C77.2 C82.1 C83.1 C84.1 CN2.2 CN6.2 CN14.2 CN15.2 H1.2 H3.4 L9.2 LED1.1 LED8.1 NOREF#8.1 NOREF#13.1 OLED1.1 Q2.2 R5.2 R6.2 R7.1 R12.1 R17.1 R25.2 R29.2 R32.1 R33.1 R48.1 R49.1 R53.1 R54.1 R55.1 R62.1 SCREW1.1 SCREW2.1 SCREW3.1 SCREW4.1 SW1.C SW1.E SW5.4 U1.2 U5.2 U9.3 U12.2 U12.3 U12.6 U12.7 U14.12 U14.18 U14.63 U15.1 U15.2 U15.3 U15.4 U16.2 U16.8 U18.1 U18.4 U18.7 U18.10 U18.13 U19.3 U21.1 U21.4 U21.7 U21.10 U21.13 USB1.1 USB1.12 USB1.13 USB1.14 USB2.1 USB2.12 USB2.13 USB2.14
PGND: C4.2 C6.1 C8.1 C9.1 C19.1 C27.1 C28.1 C29.2 C32.1 C33.2 C37.1 C39.2 C40.2 C41.1 C43.1 C44.1 C45.1 C46.2 C47.1 C51.2 C58.1 C90.1 C91.1 C92.2 C93.2 C95.1 C96.2 C99.1 C100.2 C102.1 C103.2 GND.1 L2.2 L3.3 L9.1 LED3.1 LED4.1 LED5.1 NOREF.1 NOREF#4.1 NOREF#16.1 NOREF#20.1 NOREF#22.1 Q5.1 Q5.2 Q5.3 Q6.1 Q6.2 Q6.3 Q9.1 Q9.2 Q9.3 Q10.1 Q10.2 Q10.3 Q21.1 Q21.2 Q21.3 Q22.1 Q22.2 Q22.3 Q25.1 Q25.2 Q25.3 Q26.1 Q26.2 Q26.3 R15.2 R16.1 R41.2 R42.1 SW3.1 U4.7 U4.9 U6.5 U6.16 U6.20 U6.21 U6.25 U7.5 U7.16 U7.20 U7.21 U7.25 U8.7 U8.9 U11.5 U11.16 U11.20 U11.21 U11.25 U13.5 U13.16 U13.20 U13.21 U13.25 ZD1.2 使能.1 电源.1
VIN: D6.2 D7.2 D10.2 D11.2 L3.1 NOREF#6.1 NOREF#10.1 Q7.5 Q7.6 Q7.7 Q7.8 Q7.9 Q11.5 Q11.6 Q11.7 Q11.8 Q11.9 Q23.5 Q23.6 Q23.7 Q23.8 Q23.9 Q27.5 Q27.6 Q27.7 Q27.8 Q27.9 R1.2 R8.2 U2.7
BLUTOOTH_RX: H1.3 NOREF#12.1 U14.52
BLUTOOTH_TX: H1.4 NOREF#18.1 U14.51
CANH: CN1.1 NOREF#19.1 R37.2 R45.2 U16.7
CANL: CN1.2 NOREF#9.1 R44.1 R46.1 U16.6
I2C1_SCL: NOREF#2.1 OLED1.3 R23.1 U2.4 U14.61 U15.6
I2C1_SDA: NOREF#7.1 OLED1.4 R22.1 U2.3 U14.62 U15.5
IMU_MOSI: R13.1 U12.14 U14.36
IMU_SCK: R11.1 U12.13 U14.34
LIGHT: NOREF#17.1 U14.26
LIS3_DRDY: U14.33
SERVO1: NOREF#23.1 U14.22
SERVO2: NOREF#5.1 U14.23

Pads without a net: CN1 3 4; CN2 7 8; CN6 7 8; CN14 7 8; CN15 7 8; CRYSTAL1 2 4; SW1 6 7; SW5 1 2; U1 4; U5 4; U6 9 10 11; U7 8 9 10 11; U9 4; U10 1 2 3 4 7 8 11 12; U11 8 9 10 11; U12 10 11; U13 8 9 10 11; U15 7; U16 5; U19 4; USB1 3 9; USB2 2 3 9 11

## Via types
v1: diameter 0.61, hole 0.305, Top Layer to Bottom Layer, 649 vias
v2: diameter 0.762, hole 0.457, Top Layer to Bottom Layer, 4 vias

## Routing (per net, layer and track width the routed paths; a pad name or vN(x,y) marks a point on that pad's centre or on a via; arc(x,y) is an arc through that point)
3V3: length 103.4
  Top Layer w0.254: 77.97,49.3 77.97,49.82 78.23,50.08 78.87,50.08 78.93,50.15 78.93,50.87 ; 69.35,42.37 69.69,42.37 69.85,42.22 69.85,41.69 ; 69.35,42.37 69.35,41.69 ; 69.35,42.37 69.35,43.3 C2.1
  Top Layer w0.28: 76.1,48.93 75.7,48.93 75.31,49.32 75.31,50.91 C18.1
  Top Layer w0.508: 81.08,43.15 v1(81.08,42.21) ; v1(87.88,39.34) 87.84,39.3 LED7.2 ; v1(92.71,27.48) 92.7,27.47 R20.2 R47.2 ; 78.93,50.87 78.93,51.98 v1(79.06,52.11) ; v1(90.42,14.02) 90.42,12.61 90.55,12.48 ; LED6.2 84.94,39.29 v1(83.82,39.29) ; v1(47.69,7.92) 47.69,11.67 46.86,12.49 43.81,12.49 43.12,11.8 CN14.5 ; U19.5 84.2,48.05 83.95,48.31 82.23,48.31 C67.1 82.17,50.15 v1(83.19,50.15) ; 66.95,60.71 66.85,60.8 v1(66.85,61.62) ; 85.79,9.45 85.79,11.93 86.22,12.36 90.42,12.36 90.55,12.48 ; v1(29.08,8.05) 26.86,8.05 26.35,8.56 26.35,11.41 25.53,12.24 22.48,12.24 21.91,11.67 CN15.5 ; C18.1 75.25,51.93 75.44,52.12 v1(76.2,52.12) ; U15.8 65.22,73.58 65.85,72.94 v1(67.18,72.94) ; v1(23.75,34.84) 24.83,34.84 25.02,34.66 25.02,33.45 24.77,33.19 23.88,33.19 23.62,32.94 U2.5 ; C84.2 90.55,12.48 ; 69.53,9.42 C82.2 ; 69.53,9.42 69.53,12.05 69.22,12.37 64.9,12.37 64.46,11.93 CN2.5 ; 69.53,9.42 v1(69.53,8.05) ; 79.38,43.11 79.25,42.98 v1(79.25,42.21) ; v1(68.45,43.61) 69.4,43.61 C2.1 ; R11.2 v1(77.09,42.21) ; R38.2 v1(96.52,15.42) ; v1(92.96,32.69) 92.96,32.68 91.82,32.68 ; U9.5 84.07,60.88 83.57,61.39 82.56,61.39 82.23,61.06 v1(82.23,57.32) ; R14.2 v1(75.18,42.21) ; R27.2 83.99,71.07 R26.2 v1(82.8,71.04)
  Bottom Layer w0.508: OLED1.2 48.47,69.74 48.45,69.72
  vias: v1(58.24,63.93) v1(58.22,63.01) v1(59.21,63.95) v1(59.21,63.01) v1(60.32,63.93) v1(60.32,62.99)
3V3_MCU: length 30.2
  Top Layer w0.254: U14.64 44.24,36.24 41.47,36.24 C21.1
  Top Layer w0.305: C24.1 54.36,33.32 53.85,32.81 52.58,32.81 52.25,33.14 U14.13 ; C63.1 57.59,36.56 56.9,37.25 U14.19 ; U14.48 46.25,46.63 45.82,47.06 44.7,47.06 44.64,47 ; 44.64,46.83 44.62,46.81 ; U14.1 46.25,33.34 45.97,33.07 44.39,33.07 C69.1 ; 58.23,46.66 58.14,46.74 57.24,46.74 57.02,46.53 57.02,44.12 56.66,43.75 U14.32
  Top Layer w0.508: 58.23,46.66 v1(58.23,45.51) ; R22.2 v1(37.47,37.6) ; C24.1 55.41,33.35 v1(55.41,33.95) ; C63.1 v1(58.42,37.17) ; v1(62.23,55.06) 62.6,54.69 R18.2 ; 44.59,47.11 44.64,47.06 v1(44.64,46.3) ; v1(44.54,34.43) 44.26,34.15 C69.1 ; C21.1 41.21,35.25 ; R23.2 v1(39.24,37.72)
  vias: v1(41.21,35.25) v1(62.2,55.85) v1(62.23,54.28)
5V: length 33.8
  Top Layer w0.508: 57.04,59.45 57.14,59.55 U5.3 ; 57.04,59.45 57.04,61.02 57.47,61.45 U5.1 ; 57.04,59.45 C11.2 ; v1(6.35,64.31) 6.35,63.7 R43.2 ; 55.59,59.53 55.6,59.54 55.6,60.14 55.25,60.5 53.94,60.5 53.69,60.24 53.69,58.91 55.14,57.45 C60.2 ; U16.3 80.71,67.74 v1(80.77,67.8)
  Top Layer w0.762: v2(81.79,65.58) 81.79,66.34 82.16,66.71 D8.2
  Bottom Layer w0.508: NOREF#21.1 10.8,2.79 v1(10.8,5.25) ; 33.91,69.64 v1(33.87,69.68) 5V.1 ; v1(1.4,60.5) 3.17,60.5 NOREF#14.1 ; NOREF#11.1 v1(85.77,5.13) ; NOREF#3.1 v1(57.7,4.87)
  vias: v1(49.66,59.74) v1(49.66,58.85) v1(50.67,61.52) v1(50.67,60.63) v1(50.67,59.74) v1(50.67,57.83) v1(50.67,56.82)
5V_RDK: length 19.5
  Top Layer w0.508: 9.91,70.48 6.81,70.48 6.21,69.89 R34.2 6.98,66.59 7.24,66.34 7.24,62.48 6.91,62.15 4.7,62.15 4.2,61.65 R3.2
  Top Layer w0.762: R3.2 4.2,59.47 5.12,58.56 D5.2
5V_RDK_1: length 13.4
  Top Layer w1.016: L2.4 22.58,69.92 ; CN7.1 26.92,62.7 26.92,67.23 26.35,67.8 C49.2 22.99,67.84 C48.2
DGND: length 193.5
  Top Layer w0.254: 78.01,48.43 78.01,48.2 78.28,47.93 U12.2 ; 78.01,48.43 U12.3 ; 78.01,48.43 77.09,48.43 76.96,48.56 76.96,49.29 76.97,49.3 76.97,49.97 77.25,50.24 77.47,50.24 77.47,49.3 ; 39.88,36.05 39.88,36.57 40.06,36.75 U14.63 ; 69.85,39.94 69.85,40.94 69.98,41.07 70.47,41.07 70.47,41.06 72.84,41.06 v1(73.28,40.62) 73.22,40.56 70.47,40.56
  Top Layer w0.305: 77.47,50.24 77.47,50.81 ; v1(31.74,17.8) 31.18,17.8 31.16,17.83 U21.4 ; U18.4 v1(70.99,30.53) ; v1(71.24,28.57) 71.87,28.57 U18.7 ; U18.10 v1(76.71,29.88) ; U18.13 v1(76.71,31.83) ; U21.10 36.56,17.19 36.02,17.19 34.5,15.67 v1(33.32,15.67) ; U21.7 31.29,15.88 31.5,15.67 31.5,15.59 31.27,15.36 29.27,15.36 R55.1 ; v1(53.75,37.31) 54.2,37.31 54.76,36.75 U14.18 ; R54.1 29.39,19.78 U21.1 ; v1(33.46,17.12) 33.46,17.28 35.31,19.13 U21.13 ; 51.74,34.07 51.74,35.23 51.99,35.49 v1(51.99,36.56) ; U18.1 v1(71.11,32.48)
  Top Layer w0.508: R6.2 v1(81.91,28.88) ; 56.26,72.31 56.26,71.11 ; 56.26,72.31 56.26,73.33 56.51,73.58 U15.1 ; 56.26,72.31 56.26,72.31 U15.2 ; 56.26,71.11 56.34,71.04 U15.3 ; 56.26,71.11 56.26,69.8 ; 70.93,9.57 70.96,9.55 v1(72.01,9.55) ; 92.88,53.49 92.49,53.1 USB2.12 ; v1(68.2,31.42) 68.21,31.42 R49.1 ; C11.1 56.99,55.47 52.86,55.47 52.53,55.14 52.53,54.58 51.06,54.58 v1(51.05,54.58) ; v1(43.18,46) 43.18,47.1 43.19,47.11 ; 27.75,9.57 27.78,9.6 v1(29.08,9.6) ; 56.26,69.8 v1(56.26,68.75) ; 56.26,69.8 57.91,69.8 U15.4 ; C5.2 v1(73.28,40.62) ; 90.95,45.54 90.95,44.04 91.44,43.55 91.44,42.34 ; R12.1 v1(99.19,67.84) ; R32.1 93,53.69 USB2.14 ; R62.1 68.21,29.52 v1(68.2,29.51) ; v1(36.64,9.44) 35.63,9.44 CN14.2 ; v1(57.71,65.15) 57.69,65.16 C62.1 55.71,65.96 C61.2 ; C50.2 v1(81.15,69.9) ; v1(77.62,52.14) 77.62,50.96 77.47,50.81 ; v1(89.84,70.28) 89.51,70.28 88.74,71.05 ; USB1.12 92.52,65.52 USB1.14 ; 68.9,56.83 v1(69.87,56.83) ; 80.83,58.34 v1(80.83,61.52) ; v1(72.07,44.5) 71.95,44.5 70.93,43.48 ; v1(30.81,20.98) 29.45,20.98 29.07,20.61 R54.1 ; R55.1 v1(29.08,14.4) ; L9.2 49.7,54.55 v1(49.7,55.43) ; C70.2 v1(59.63,45.51) 59.63,46.66 ; C73.1 v1(94.11,15.48) ; C66.2 v1(83.19,51.55) ; C63.2 58.99,35.16 v1(59.44,34.72) ; v1(58.04,33.35) 56.86,33.35 C24.2 ; C76.1 50.1,31.67 v1(52.98,31.67) v1(55.37,31.67) 55.75,31.29 v1(55.75,30.55) v1(55.75,28.64) v1(55.75,26.72) 55.43,26.4 v1(54.32,26.4) v1(52.32,26.4) C74.1 v1(47.97,26.4) C77.2 v1(43.51,26.4) 42.23,26.4 v1(41.66,26.97) v1(41.66,29.34) v1(41.66,31.16) 42.23,31.73 v1(43.66,31.73) C75.2 ; 43.12,33.19 v1(41.66,33.19) ; 65.85,71.55 v1(65.85,70.41) ; R17.1 v1(98.81,55.93) ; U16.8 v1(73.66,65.2) ; R48.1 v1(81.91,30.65) ; CN15.2 14.53,9.57 v1(15.62,9.57) ; LED8.1 63.82,60.99 v1(63.81,61.01) ; 91.69,22.84 C53.1 ; v1(79.3,9.32) 78.05,9.32 CN6.2 ; 92.49,46.12 92.49,45.55 USB2.13 ; v1(73.79,49.58) 73.85,49.64 73.85,50.97 ; R29.2 39.62,13.64 39.28,13.31 v1(39.28,11.1) ; R25.2 67.09,54.19 v1(67.08,54.2) ; 59.57,54.53 v1(58.52,54.53) ; 49.09,9.44 49.11,9.47 v1(50.24,9.47) ; C54.1 v1(93.6,22.84) ; R5.2 v1(41.15,39.27) ; 80.96,34.59 v1(82.04,34.59) ; C34.1 v1(40.38,22.65) ; U19.3 v1(85.47,50.08) ; 54.64,59.53 54.64,59.03 55.07,58.59 v1(55.27,58.59) ; C84.1 v1(90.55,7.92) ; CN2.2 57.05,9.55 v1(58.22,9.55) ; U5.2 v1(59.31,60.5) ; USB1.1 92.52,57.96 93.07,57.42 92.6,56.94 C16.1 ; R53.1 v1(40.51,20.62) ; v1(45.49,49.35) 45.5,49.34 C72.2 ; U9.3 v1(85.34,62.53) ; 79.63,66.4 77.64,66.4 U16.2 v1(76.2,66.47) ; 89.79,32.62 v1(88.98,32.62) ; 74.2,71.17 v1(74.2,69.9) ; 39.81,35.99 v1(38.66,35.99) ; 58.97,57.04 v1(58.97,55.95) ; R7.1 v1(62.23,41.83) ; 97.52,13.74 v1(97.52,14.91)
  Bottom Layer w0.508: 45.4,69.72 45.85,70.16 ; OLED1.1 45.93,69.99 45.66,69.72 ; NOREF#8.1 3.03,61.63 v1(1.51,61.63)
  vias: v1(60.15,68.55)
DVDD: length 80.5
  Top Layer w0.254: U21.14 37.26,19.78 37.43,19.95 37.43,21.38 37.68,21.64 37.92,21.64 38.23,21.94 38.23,22.59 C34.2 38.16,23.1 38.62,23.55 v1(49.03,23.55)
  Top Layer w0.33: v1(66.08,34.89) 73.42,34.89 ; 73.42,34.89 75.17,34.89 75.69,34.37 75.69,34.34 75.93,34.1 78.61,34.1 ; 73.42,34.89 73.42,21.51 73.16,21.26 70.49,21.26 70.04,20.81 C90.2 70.04,18.52 69.74,18.22 U6.8 ; C38.2 79.33,34.1 78.61,34.1 ; v1(52.25,23.91) 52.52,24.18 57.28,24.18 57.77,24.67 57.77,28.23 58.29,28.75 63.42,28.75 64.01,29.33 v1(64.01,34.83) ; 78.61,34.1 78.61,32.69 78.4,32.48 U18.14
  Bottom Layer w0.254: v1(64.01,34.83) 64.06,34.89 v1(66.08,34.89) ; v1(52.25,23.91) 51.9,23.55 v1(49.03,23.55)
GND: length 10.5
  Top Layer w0.508: U2.6 v1(22.35,33.83) ; C56.1 12.39,43.09 v1(11.51,43.09) ; U2.2 v1(21.08,27.99) ; U2.1 v1(19.81,28.11) ; v1(25.45,27.99) 25.86,27.99 L3.2 ; R50.1 v1(1.28,52.62) ; C1.1 v1(26.42,35.73) ; C57.1 v1(15.37,42.34)
  vias: v1(25.43,27.15)
PGND: length 159.7
  Top Layer w0.305: U11.16 50.04,18.97 U11.21 ; v1(49.4,19.61) 49.26,19.47 U11.20 ; 78.04,20.36 80.15,20.36 ; 81.15,19.48 U7.25 ; 81.15,19.48 81.15,18.84 81.9,18.09 U7.5 ; 81.15,19.48 80.9,19.73 80.9,20.36 ; 81.15,19.48 v1(81.92,18.72) ; 80.9,20.36 U7.16 ; 80.9,20.36 80.97,20.42 v1(81.84,20.42) ; 80.9,20.36 80.15,20.36 ; 65.41,19.47 v1(65.41,19.5) 65.41,20.23 65.66,20.48 U6.16 ; 65.41,19.47 65.16,19.72 U6.20 ; 65.41,19.47 65.66,19.22 U6.21 ; U13.20 18.94,19.59 18.74,19.79 v1(18.74,20.75) ; 80.15,20.36 80.65,19.86 78.04,19.86 ; U13.5 22.47,18.57 22.07,18.97 ; U11.5 51.04,17.2 v1(50.35,17.9) 49.66,18.59 v1(49.66,18.72) ; U6.25 66.66,18.22 U6.5 ; U13.16 21.47,20.35 21.62,20.21 v1(21.62,19.27)
  Top Layer w0.33: v1(21.62,19.27) 21.77,19.27 22.07,18.97 ; v1(21.62,19.27) 21.29,19.59 U13.20 ; v1(21.62,19.27) 21.44,19.09 U13.21
  Top Layer w0.508: 32.84,27.5 33.25,27.91 v1(33.75,27.91) ; v1(48.31,55.44) 48.32,55.43 L9.1 ; C102.1 v1(25.91,20.81) ; C92.2 v1(72.26,22.65) ; C39.2 v1(11.43,55.8) ; C6.1 25.15,56.25 v1(25.15,55.04) ; 71.91,18.33 71.91,19.01 C90.1 71.54,19.58 73.62,19.58 C29.2 ; v1(41.91,59.06) 41.91,59.21 41.63,59.48 U8.7 ; C91.1 v1(71.96,16.68) ; LED3.1 v1(1.18,62.4) ; 14.28,66.87 v1(14.28,68.25) ; v1(57.63,17.45) 56.45,17.45 56.2,17.7 ; C47.1 v1(14.48,63.04) ; v1(59.82,18.08) 59.82,17.13 C51.2 ; v1(46.71,66.44) 49,66.44 49.03,66.47 ; 56.33,14.53 57.09,15.29 v1(57.55,15.29) ; v1(72.14,15.29) 73.03,16.18 C27.1 ; v1(36.58,53.26) C43.1 ; C28.1 v1(59.88,15.54) ; C33.2 86.49,17.89 C32.1 86.49,21.89 85.93,22.45 83.39,22.45 82.76,23.07 v1(82.76,24.05) ; R15.2 v1(14.35,60.75) ; U4.7 v1(15.11,56.31) ; LED5.1 24.92,37.74 v1(23.75,37.74) ; R16.1 25.27,58.48 v1(25.27,59.36) ; R41.2 45.58,54.11 v1(45.57,54.12) ; v1(1.19,69.01) 1.18,69 LED4.1 ; R42.1 v1(40.13,55.04) ; v1(25.57,12.98) 25.57,13.48 C103.2 ; 44,16.16 C37.1 43.5,14.02 v1(42.8,14.02) ; 44,16.16 43.37,16.16 v1(42.86,15.65) ; 44,16.16 C93.2 ; ZD1.2 12.95,12.7 13.52,12.14 v1(14.78,12.14) ; C9.1 3.61,57.65 v1(3.68,57.58) ; v1(16.05,13.71) 15.9,13.86 v1(15.9,14.8) 15.9,17.04 v1(16,17.14) 16,17.89 16.08,17.97 v1(16.08,19.12) ; 31.18,58.21 31.12,58.15 v1(31.12,57.2) ; C8.1 v1(22.92,61.64) ; C45.1 C19.1 ; C58.1 v1(28.07,34.72) ; C44.1 v1(43.81,70.53)
  Top Layer w0.762: SW3.1 3.3,22.78 3.8,22.28 电源.1 12.93,22.28 使能.1
  Bottom Layer w0.508: v1(80.8,13.26) 80.75,13.26 v1(80.28,13.73) 79.83,14.18 v1(79.8,14.18) 79.58,14.4 Q6.3 Q6.2 Q6.1 ; 40.18,16.25 40.18,13.71 ; Q5.1 83.06,13.25 ; 83.06,13.25 83.06,15.78 ; 83.06,13.25 v1(83.05,13.27) ; NOREF#22.1 v1(88.69,5.13) ; NOREF#20.1 v1(60.62,4.75) ; 18.73,12.97 18.73,15.51 ; v1(36.19,69.9) 36.16,69.94 GND.1 ; Q21.3 Q21.2 Q21.1 64.08,12.67 v1(63.14,12.67) v1(62.34,12.67) v1(61.44,12.67) ; 57.55,15.28 v1(57.55,14.6) Q22.3 ; 57.55,15.28 Q22.2 57.52,15.33 v1(57.52,15.94) 57.58,16 v1(57.58,16.81) ; 57.55,15.28 v1(57.55,15.29) ; NOREF#4.1 v1(13.75,5.25) ; Q26.1 Q26.2 Q26.3 15.85,13.91 v1(16.05,13.71)
  Bottom Layer w0.635: 18.73,12.97 18.08,12.32 v1(18.08,11.49) v1(18.08,10.62) 18.08,9.85 v1(18.06,9.83)
  Bottom Layer w0.762: v1(42.86,15.65) 42.82,15.61 v1(42.82,14.72) v1(42.82,13.38)
  vias: v1(5.84,8.58) v1(5.87,7.67) v1(6.76,8.61) v1(6.75,7.67) v1(7.67,8.63) v1(7.7,7.72) v1(15.16,17.22) v1(15.16,16.02) v1(15.19,14.78) v1(15.19,13.74) v1(18.29,58.21) v1(18.29,57.07) v1(18.29,55.93) v1(19.59,58.21) v1(19.59,57.07) v1(19.59,55.93) v1(22.44,19.26) v1(24.54,47.67) v1(25.53,47.67) v1(26.72,47.67) v1(28.32,53.81) v1(28.32,52.62) v1(28.32,51.48) v1(28.38,47.67) v1(29.46,47.67) v1(30.61,47.67) v1(33.76,27.12) v1(37.21,60.12) v1(37.34,58.85) v1(37.34,57.58) v1(38.61,58.72) v1(38.65,57.58) v1(38.74,60.12) v1(40.61,15.62) v1(40.61,14.83) v1(40.61,14.02) v1(40.64,13.25) v1(49.4,17.83) v1(50.34,19.55) v1(50.77,18.72) v1(51.18,19.61) v1(51.18,17.83) v1(57.51,13.61) v1(65,13.41) v1(71.96,18.33) v1(79.07,13.86) v1(79.65,16.18) v1(81.91,19.61) v1(82.23,13.97) v1(82.19,13.25) v1(82.63,12.62) v1(92.74,8.68) v1(92.76,7.73) v1(93.83,8.68) v1(93.84,7.73) v1(94.94,8.66) v1(94.97,7.72)
VBUS: length 11.8
  Top Layer w0.508: v1(90.3,64.28) 90.3,66.21 89.92,66.59 88.01,66.59 D8.1 ; USB1.2 91.33,59.34 v1(91.31,59.36) ; USB1.11 v1(91.31,64.14)
  Bottom Layer w0.508: v1(91.31,59.36) v1(91.31,60.19) v1(91.31,63.25) v1(91.31,64.14)
  vias: v1(90.17,60.63) v1(90.17,59.48)
VCCBAT:
  vias: v1(30.96,30.43) v1(30.96,29.36) v1(31.12,32.94) v1(31.12,32.02) v1(32.13,32.94) v1(32.14,32.02) v1(33.15,32.94)
VIN: length 81.4
  Top Layer w0.635: D7.2 45.68,21.98 48.74,21.98 ; D10.2 v1(60.19,22.7)
  Top Layer w0.762: 3.17,11.35 9.27,11.35 10.54,12.62 R8.2 ; 75.44,24.35 75.46,24.38 v2(75.46,25.55) ; 20.95,29.13 19.58,29.13 18.97,28.52 18.97,23.84 18.46,23.34 D11.2 17.27,23.08 v1(14.86,23.08)
  Bottom Layer w0.508: v1(60.19,22.7) 60.18,22.69 60.03,22.69
  Bottom Layer w0.635: v1(56.46,22.78) 56.55,22.69 60.03,22.69 ; v1(48.92,21.98) 49.01,21.89 54.68,21.89 v1(54.86,21.71)
  Bottom Layer w0.762: v2(76.96,24.43) 77.72,24.43 78.23,24.94 81.91,24.94 82.68,25.7 91.19,25.7 92.07,24.81 92.07,22.76 94.21,20.63 94.21,18.24 95.08,17.36 95.08,12.42 v1(94.56,11.91) ; v1(9.35,24.43) 7.62,24.43 6.6,23.42 6.6,12.79 v1(7,12.39)
  vias: v1(5.99,12.39) v1(5.96,11.25) v1(5.96,10.11) v1(7,11.25) v1(7,10.11) v1(8.05,12.39) v1(8.05,11.25) v1(8.05,10.11) v1(9.2,21.44) v1(9.17,20.16) v1(10.19,24.46) v1(10.97,24.05) v1(12.22,24.05) v1(13.44,24) v1(14.86,23.92) v1(21.31,29.26) v1(21.37,30.4) v1(22.45,30.4) v1(22.39,29.26) v1(23.33,30.4) v1(23.27,29.26) v1(24.24,29.26) v1(24.26,30.4) v1(25.2,29.26) v1(26.8,29.26) v1(28.19,29.26) v1(35.36,20.09) v1(36.02,20.7) v1(36.68,21.38) v1(36.83,20.44) v1(37.21,22.86) v1(37.18,22.05) v1(53.34,22.65) v1(53.37,20.9) v1(54.86,22.78) v1(54.86,20.31) v1(56.48,21.71) v1(56.48,20.31) v1(74.12,25.04) v1(74.35,25.93) v1(74.47,22.4) v1(75.49,22.37) v1(76.45,25.19) v1(76.56,22.45) v1(92.96,11.86) v1(92.96,10.72) v1(92.96,9.83) v1(93.8,11.93) v1(93.8,10.69) v1(93.83,9.85) v1(94.69,10.87) v1(94.69,9.85) v2(74.12,24.18)
BLUTOOTH_RX: length 72.4
  Top Layer w0.254: U14.52 44.24,42.26 42.48,42.26 41.91,42.83 40.33,42.83 v1(40.27,42.77)
  Bottom Layer w0.254: v1(40.27,42.77) 40.27,44.11 39.88,44.5 16.13,44.5 15.88,44.75 15.88,49.7 15.37,50.21 13.46,50.21 12.95,50.72 12.95,64.94 ; 12.95,64.94 NOREF#12.1 ; 12.95,64.94 14.99,64.94 15.49,65.45 15.49,73.2
BLUTOOTH_TX: length 89.7
  Top Layer w0.254: v1(39.64,43.76) 39.66,43.76 40.07,43.35 41.89,43.35 42.5,42.75 U14.51
  Bottom Layer w0.254: v1(39.64,43.76) 15.09,43.76 14.48,44.37 14.48,46.78 13.59,47.67 5.97,47.67 5.08,48.56 5.08,57.7 4.44,58.34 1.02,58.34 0.6,58.76 0.6,66.94 1.14,67.48 NOREF#18.1 7.49,67.48 7.94,67.93 7.94,73.77 8.64,74.47 16.76,74.47 18.03,73.2
BOOT0: length 3.2
  Top Layer w0.254: U14.60 41.31,38.25 R5.1
BOOT1: length 3.8
  Top Layer w0.254: R7.2 59.47,41.75 U14.28
BUZZER: length 39
  Top Layer w0.254: R25.1 v1(69.7,53.44) ; U14.11 51.25,37.07 52.38,38.2 v1(52.38,39.47) ; R21.1 68.58,53.13
  Bottom Layer w0.254: v1(52.38,39.47) 52.4,39.49 52.4,46.1 52.88,46.58 64.24,46.58 65.13,47.47 69.24,47.47 69.66,47.89 69.66,53.4 v1(69.7,53.44)
CAN1_RX: length 69.3
  Top Layer w0.254: v1(44.96,50.64) 40.94,50.64 40.49,50.19 40.49,45.2 40.74,44.95 44.84,44.95 45.97,43.82 47.78,43.82 48.25,44.29 U14.44 ; U16.4 75.95,69.01 75.44,68.5 75.44,64.56 74.93,64.06 65.3,64.06 65.05,63.8 65.05,54.17 64.28,53.41 47.4,53.41 v1(47.29,53.51)
  Bottom Layer w0.254: v1(44.96,50.64) 46.41,50.64 46.61,50.85 46.61,53.26 46.86,53.51 v1(47.29,53.51)
CAN1_TX: length 63.4
  Top Layer w0.254: U14.45 47.75,44.5 47.57,44.32 45.97,44.32 44.9,45.39 41.15,45.39 40.97,45.57 40.97,49.65 41.4,50.08 44.01,50.08 v1(44.04,50.05) ; U16.1 76.2,65.2 75.95,64.94 75.95,64.06 75.44,63.55 65.71,63.55 65.46,63.29 65.46,53.56 64.94,53.05 48.99,53.05 48.7,52.75 v1(47.35,52.75)
  Bottom Layer w0.254: v1(44.04,50.05) 47.09,50.05 47.35,50.31 v1(47.35,52.75)
CANH: length 29
  Top Layer w0.254: v1(71.86,69.97) 71.85,69.98 R45.2 R37.2 69.6,66.72 69.85,66.47 U16.7
  Bottom Layer w0.254: 72.97,69.96 72.97,71.37 NOREF#19.1 ; 72.97,69.96 72.96,69.97 v1(71.86,69.97) ; 72.97,69.96 72.97,69.67 73.86,68.78 83.03,68.78 83.38,68.43 83.38,65.36
CANL: length 26.7
  Top Layer w0.254: R46.1 v1(76.55,70.02) ; R46.1 75.45,71.18 75.06,70.79 75.06,67.99 74.8,67.74 U16.6 ; R46.1 R44.1
  Bottom Layer w0.254: v1(76.55,70.02) 76.58,70 77.16,70 ; 77.16,70 77.16,69.68 77.65,69.19 84.84,69.19 85.88,68.14 85.88,65.36 ; 77.16,70 NOREF#9.1
DEBUG_RX: length 48.1
  Top Layer w0.254: U9.6 85.34,57.32 84.76,56.74 71.81,56.74 70.87,55.8 70.87,53.13 70.43,52.69 49.25,52.69 v1(48.67,52.11) ; U14.43 48.75,49.91 48.64,50.02 48.64,50.45 v1(48.72,50.53)
  Bottom Layer w0.254: v1(48.72,50.53) 48.72,52.05 v1(48.67,52.11)
DEBUG_TX: length 48.7
  Top Layer w0.254: U14.42 49.25,50.23 v1(49.6,50.59) ; v1(49.61,52.11) 70.73,52.11 71.37,52.75 71.37,55.55 72.21,56.38 85.93,56.38 86.61,57.07 U9.7
  Bottom Layer w0.254: v1(49.61,52.11) 49.61,51.69 49.6,51.68 v1(49.6,50.59)
GMR_L1A: length 60.6
  Top Layer w0.254: CN2.4 61.96,11.32 61.04,12.24 59.69,12.24 58.98,12.95 58.98,27.73 59.23,27.99 v1(63.37,27.99) ; U14.58 46.06,39.25 46.31,39.5 46.31,41.79 46.95,42.42 v1(53.11,42.42) ; v1(63.37,39.15) v1(63.37,29.77)
  Bottom Layer w0.254: v1(63.37,39.15) 62.79,39.74 53.3,39.74 53.11,39.92 v1(53.11,42.42) ; v1(63.37,29.77) v1(63.37,27.99)
GMR_L1B: length 64.5
  Top Layer w0.254: U14.59 46.06,38.75 46.67,39.36 46.67,41.13 47.38,41.84 53.85,41.84 ; v1(60.02,26.84) 64.26,26.84 64.64,27.22 v1(64.64,28.88) ; CN2.3 59.46,11.97 58.34,13.08 58.34,26.84 v1(58.4,26.89)
  Bottom Layer w0.254: v1(64.64,28.88) 64.64,30.4 65.02,30.78 66.29,30.78 67.06,31.54 67.06,35.86 66.04,36.88 66.04,39.8 65.41,40.43 54.36,40.43 54.07,40.72 v1(54.07,41.84) ; v1(58.4,26.89) 58.45,26.84 v1(60.02,26.84)
GMR_L2A: length 110.5
  Top Layer w0.254: U14.37 51.75,48.64 52.5,49.39 71.56,49.39 72.16,48.79 72.16,46.12 v1(73.03,45.26) ; v1(91.06,19.1) 91.06,14.14 91.55,13.66 91.55,7.22 90.5,6.17 83.16,6.17 82.91,6.42 CN6.4 ; v1(81.66,40.56) 81.66,38.53 81.91,38.27 83.19,38.27 83.2,38.27 87.89,38.27 89.03,37.13 v1(89.03,34.84) 89.03,34.08 89.53,33.58 98.81,33.58 99.06,33.32 99.06,19.73 97.79,18.46 93.73,18.46 93.12,19.07 93.12,19.1
  Bottom Layer w0.254: v1(81.66,40.56) 81.53,40.69 74.04,40.69 73.79,40.94 73.79,44.5 v1(73.03,45.26) ; 93.12,19.1 v1(91.06,19.1)
  vias: v1(93.17,19.1)
GMR_L2B: length 112
  Top Layer w0.254: v1(91.95,18.08) 91.9,18.03 91.9,6.99 90.63,5.71 81.11,5.71 80.41,6.41 CN6.3 ; v1(82.68,39.29) 83.34,38.62 88.17,38.62 90.59,36.21 97.83,36.21 99.44,34.59 99.44,19.61 97.87,18.04 v1(93.17,18.04) ; v1(73.81,45.49) 72.52,46.78 72.52,49.2 71.97,49.75 51.86,49.75 51.25,49.14 U14.38
  Bottom Layer w0.254: v1(73.81,45.49) 74.42,44.88 74.42,41.45 74.68,41.19 82.3,41.19 82.68,40.81 v1(82.68,39.29) ; v1(91.95,18.08) 91.99,18.04 v1(93.17,18.04)
GMR_R1A: length 65
  Top Layer w0.254: v1(42.75,35.61) 42.75,35.05 42.34,34.64 37.26,34.64 36.83,34.21 v1(36.83,27.22) ; v1(40.59,6.4) 40.62,6.42 CN14.4 ; U14.56 42.92,40.25 v1(42.8,40.13)
  Bottom Layer w0.254: v1(40.59,6.4) 40.52,6.32 28.27,6.32 27.05,7.54 27.05,23.92 28.12,24.99 35.46,24.99 36.83,26.36 v1(36.83,27.22) ; v1(42.8,40.13) 42.75,40.08 v1(42.75,35.61)
GMR_R1B: length 67.8
  Top Layer w0.254: v1(38.1,5.49) 38.1,9.43 CN14.3 ; v1(45.72,39.88) 45.59,39.75 U14.57
  Bottom Layer w0.254: v1(38.1,5.49) 27.32,5.49 26.62,6.19 26.62,24.25 27.71,25.34 35,25.34 36.07,26.41 36.07,34.08 36.65,34.67 42.88,34.67 43.56,35.35 43.56,39.54 43.89,39.88 v1(45.72,39.88)
GMR_R2A: length 65.1
  Top Layer w0.254: v1(46.35,43.23) 46.33,43.25 U14.50
  Bottom Layer w0.254: v1(46.35,43.23) 46.35,42.52 46.18,42.34 42.42,42.34 42.16,42.08 42.16,37.24 41.67,36.75 36.19,36.75 35.56,36.11 35.56,26.7 34.56,25.7 26.11,25.7 25.55,25.14 18.34,25.14 17.27,24.08 17.27,9.76 18.03,9 19.19,9 19.38,9.19 v1(19.38,9.57)
GMR_R2B: length 58
  Top Layer w0.254: U14.55 42.48,40.75 41.78,41.45 37.86,41.45 v1(37.82,41.49)
  Bottom Layer w0.254: v1(16.76,9.44) 16.92,9.6 16.92,24.38 18.09,25.55 25.4,25.55 25.91,26.06 34.41,26.06 35.05,26.7 35.05,40.81 35.73,41.49 v1(37.82,41.49)
I2C1_SCL: length 116
  Top Layer w0.254: 24.13,27.86 23.62,27.35 U2.4 23.62,24.23 23.88,23.97 33.05,23.97 34.79,25.72 34.79,39.93 37.36,42.5 37.36,51.63 37.97,52.24 v1(40.89,52.24) 46.1,52.24 46.35,52.5 46.35,63.17 47.35,64.16 50.77,64.16 51.23,64.61 51.23,67.64 ; 51.23,67.64 51.23,73.15 50.93,73.45 ; 51.23,67.64 60.55,67.64 61.09,68.17 61.09,70.79 61.34,71.04 U15.6 ; U14.61 44.23,37.73 40.42,37.73 40.25,37.9 v1(40.25,39.94) 40.23,39.92 39.37,39.92
  Bottom Layer w0.254: OLED1.3 51.01,69.95 51.24,69.72 ; v1(40.25,39.94) 40.85,40.54 40.85,52.21 v1(40.89,52.24)
I2C1_SDA: length 123.6
  Top Layer w0.254: 36.25,40.74 35.15,39.64 35.15,25.44 33.32,23.62 22.61,23.62 22.35,23.87 U2.3 ; 36.25,40.74 37.95,42.44 37.95,51.2 38.35,51.61 46.46,51.61 46.71,51.86 46.71,62.94 47.32,63.55 51,63.55 52.02,64.56 52.02,66.87 52.27,67.13 61.35,67.13 61.77,67.55 61.77,69.21 62.33,69.77 U15.5 63.52,69.72 67.31,69.72 67.92,70.33 67.92,73.96 67.62,74.27 54.28,74.27 53.47,73.45 ; 36.25,40.74 36.25,40.64 36.97,39.92 R22.1 38.24,39.92 38.35,39.8 38.35,37.39 38.61,37.13 42.84,37.13 42.96,37.25 U14.62
  Bottom Layer w0.254: 53.91,69.72 53.91,73.27 OLED1.4
IMU_CS: length 45.5
  Top Layer w0.254: v1(66.98,48.51) 67.06,48.43 70.56,48.43 71.5,47.49 71.5,45.96 72.84,44.62 75.31,44.62 75.31,46.02 75.49,46.2 76.64,46.2 76.97,46.53 U12.12 ; U14.8 49.75,37.1 50.27,37.61 v1(50.27,39.45)
  Bottom Layer w0.254: v1(50.27,39.45) 50.27,47.9 50.8,48.43 66.9,48.43 v1(66.98,48.51)
  vias: v1(70.35,48.38)
IMU_INT: length 40.3
  Top Layer w0.254: 78.84,48.93 80.76,48.93 80.91,49.08 80.91,51.54 79.7,52.75 74.29,52.75 71.64,50.1 51.45,50.1 50.75,49.4 U14.39
